# Altium schematic sheet UC3842内部梳理.SchDoc
size 1651 x 1651 mm; SheetNumber: 10; SheetTotal: 16
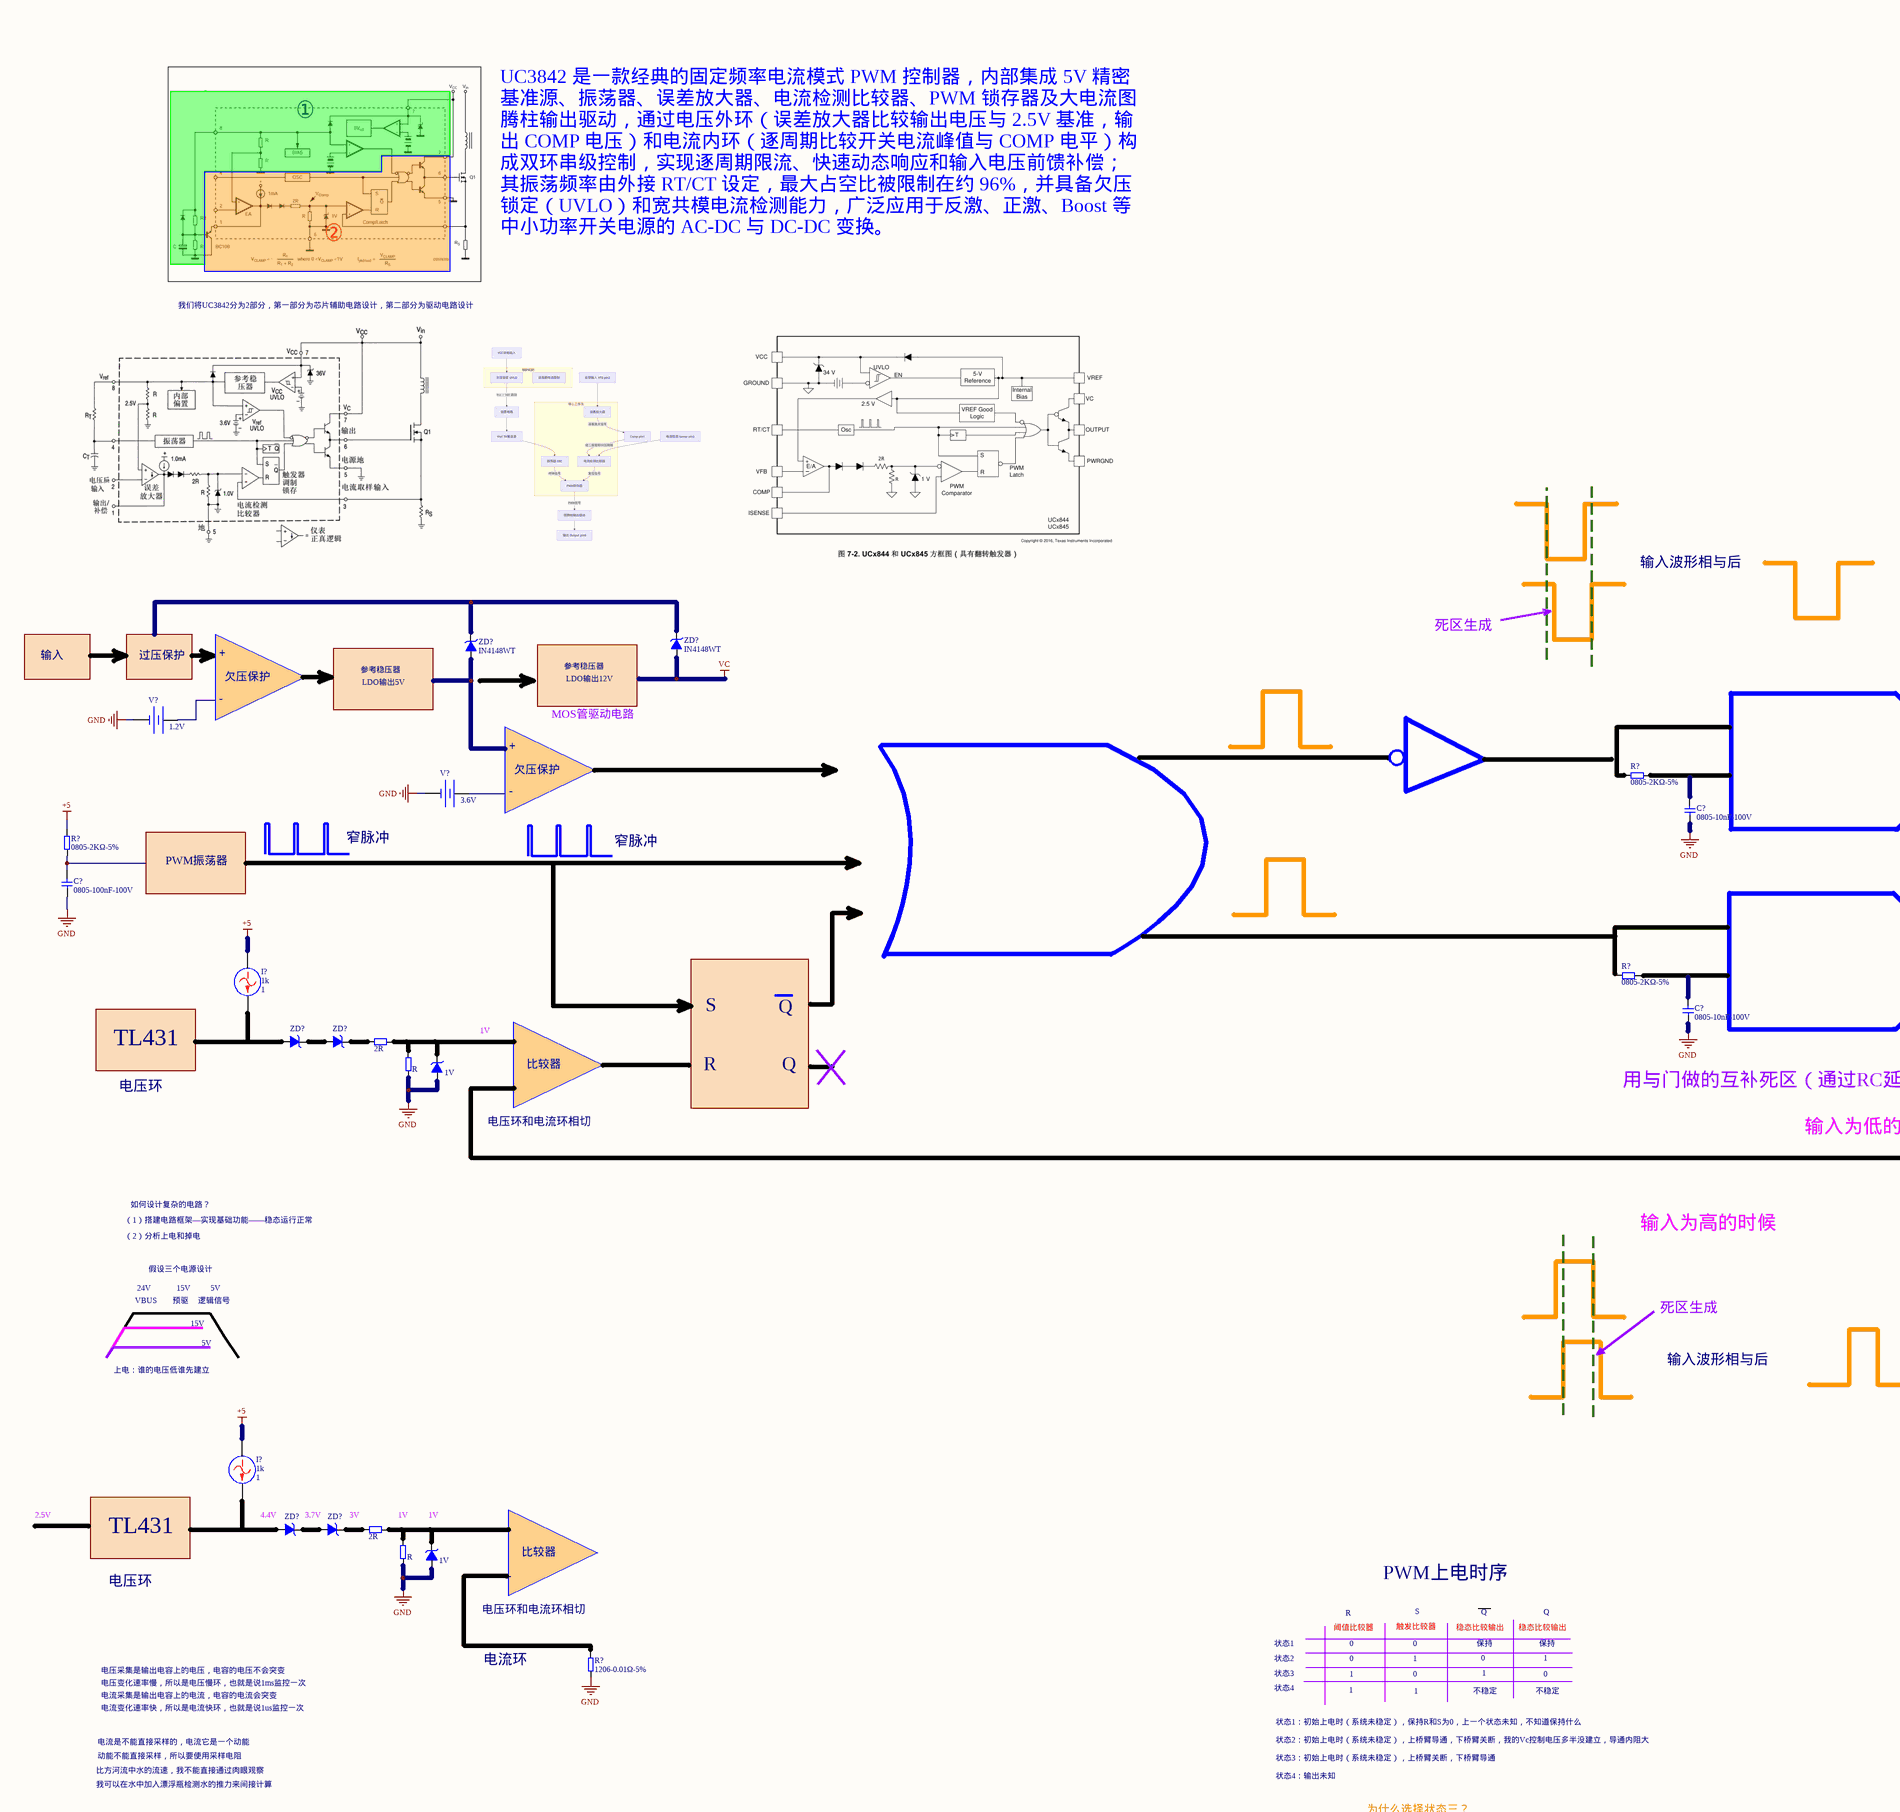
[diagram p0: UC3842内部梳理.SchDoc, top left]
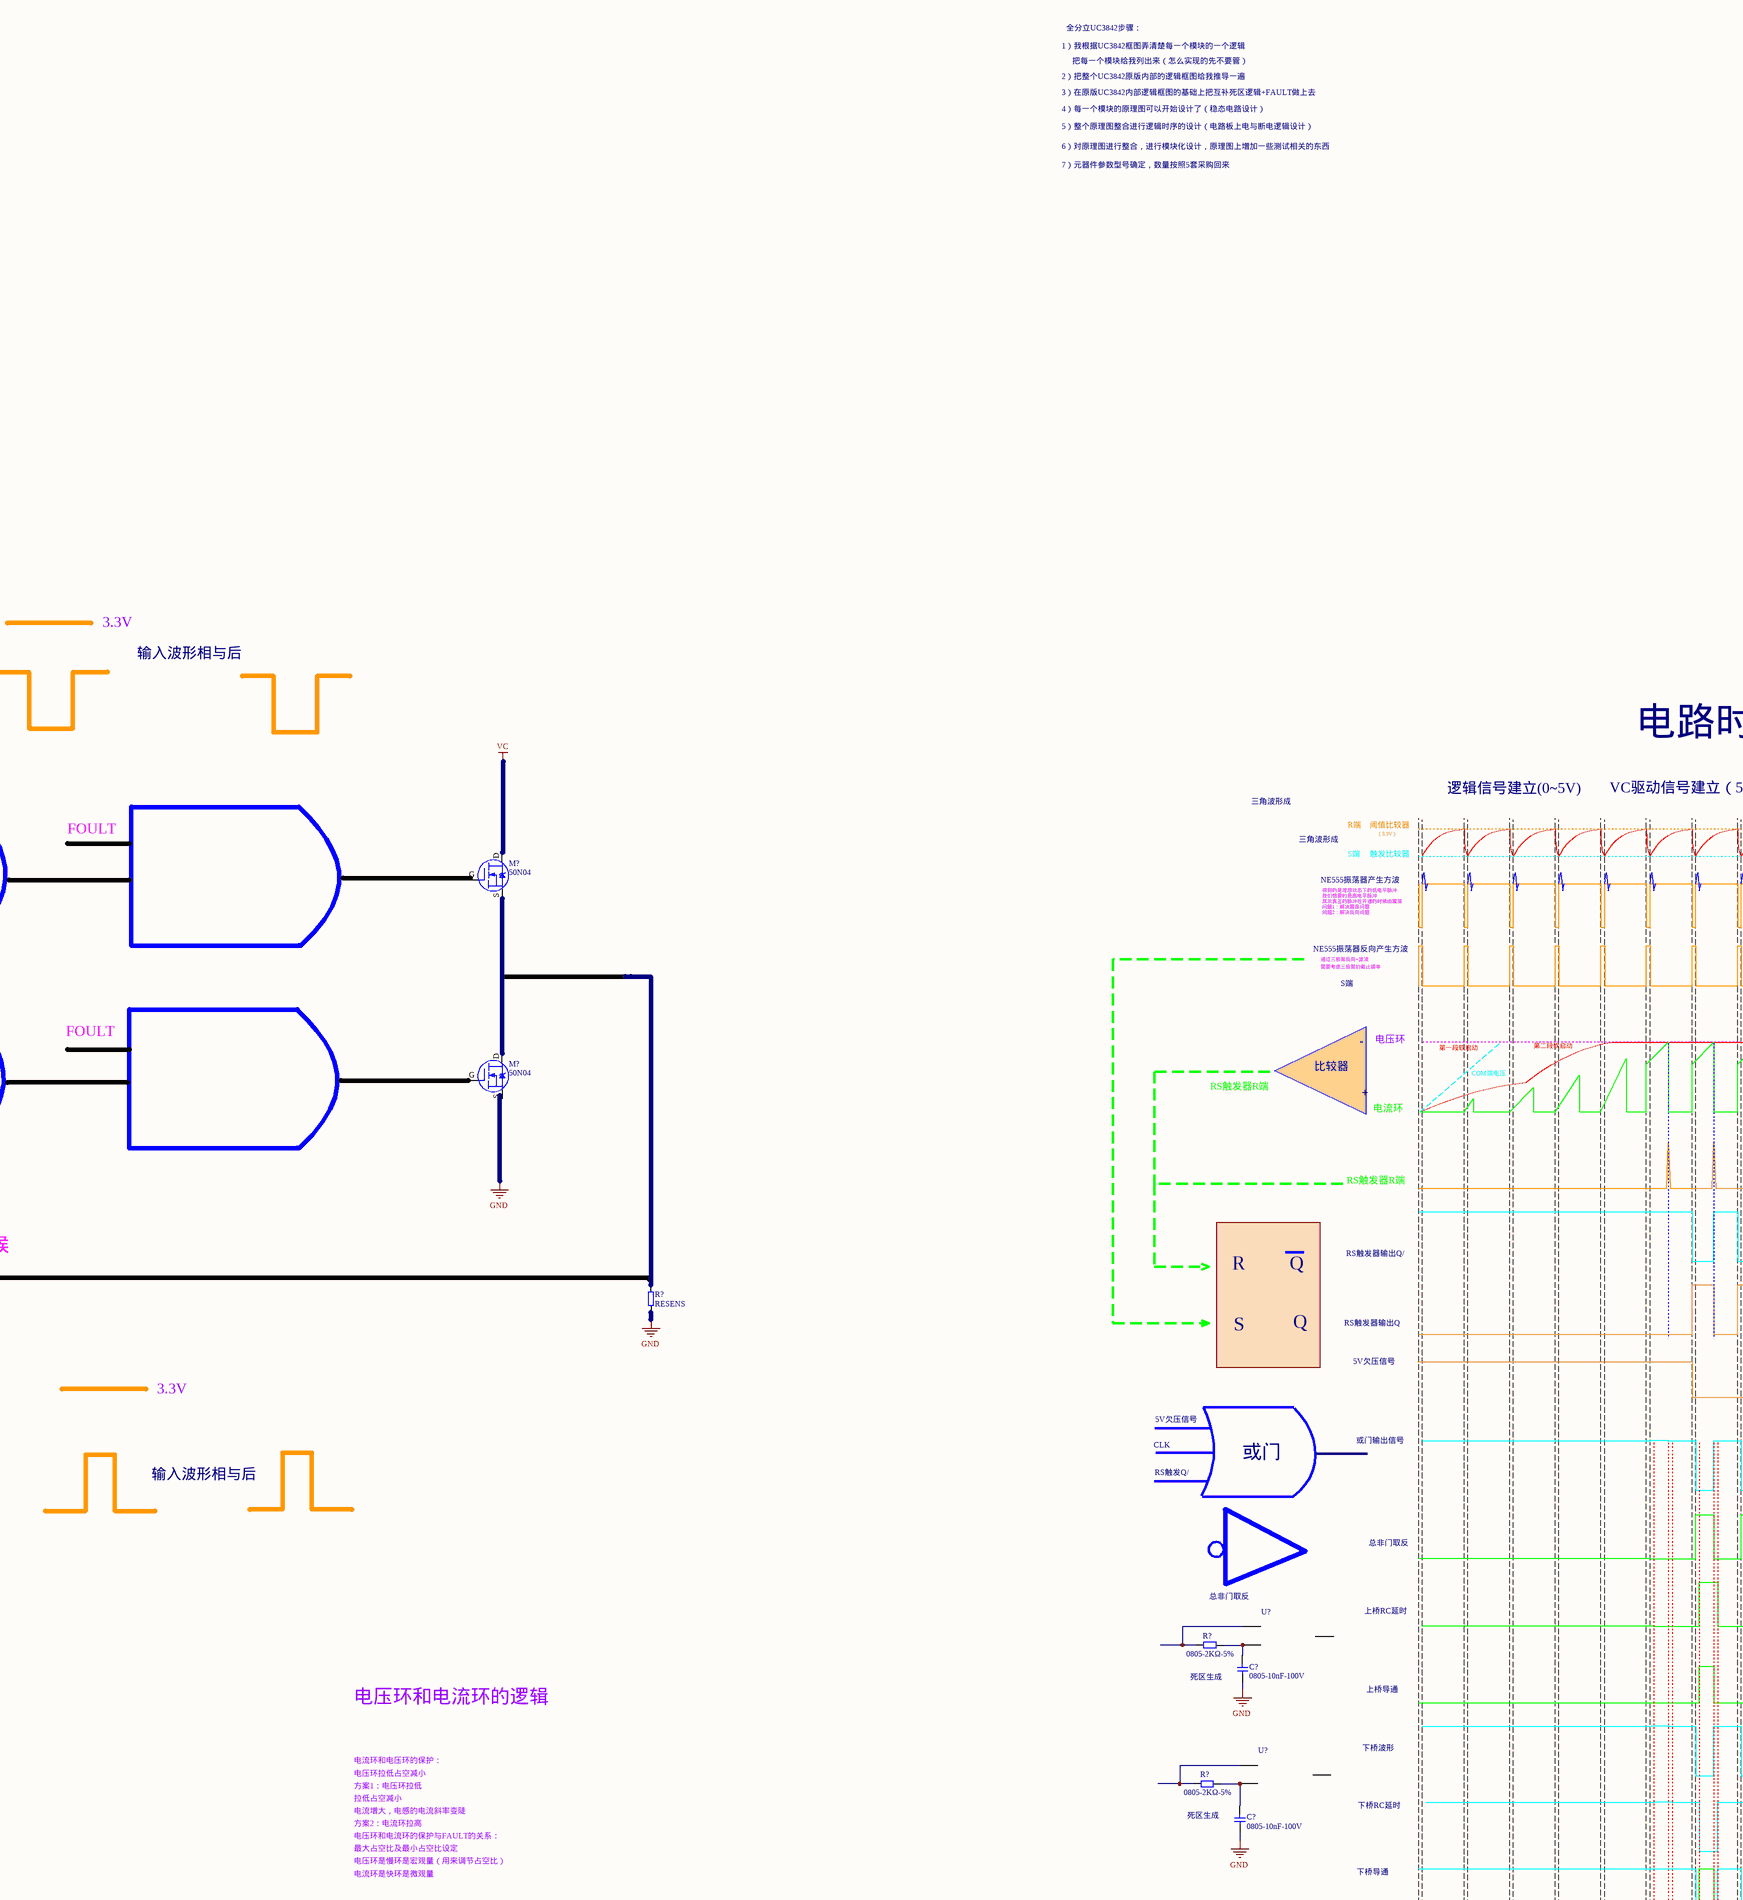
[diagram p1: UC3842内部梳理.SchDoc, top middle]
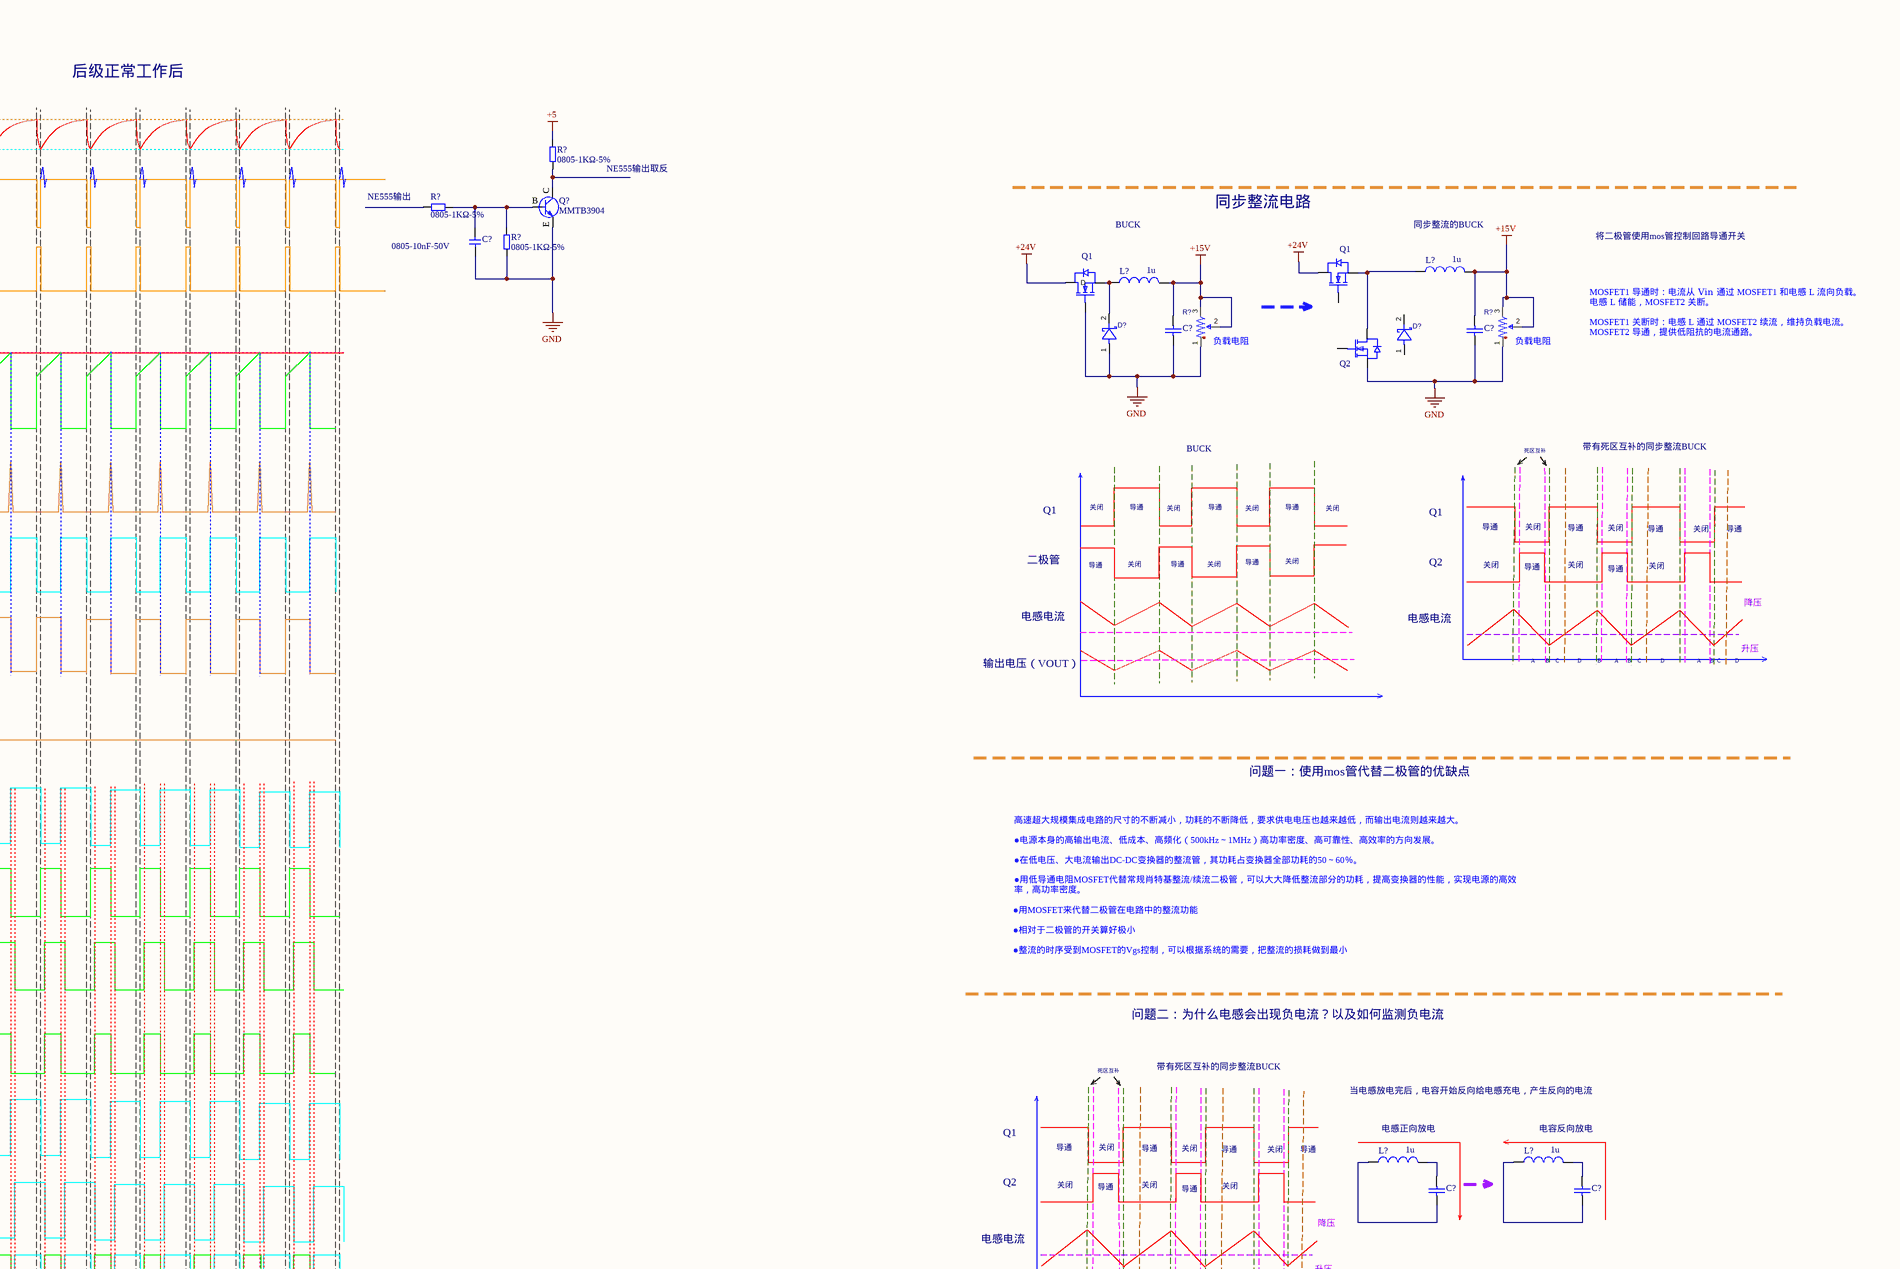
[diagram p2: UC3842内部梳理.SchDoc, top right]
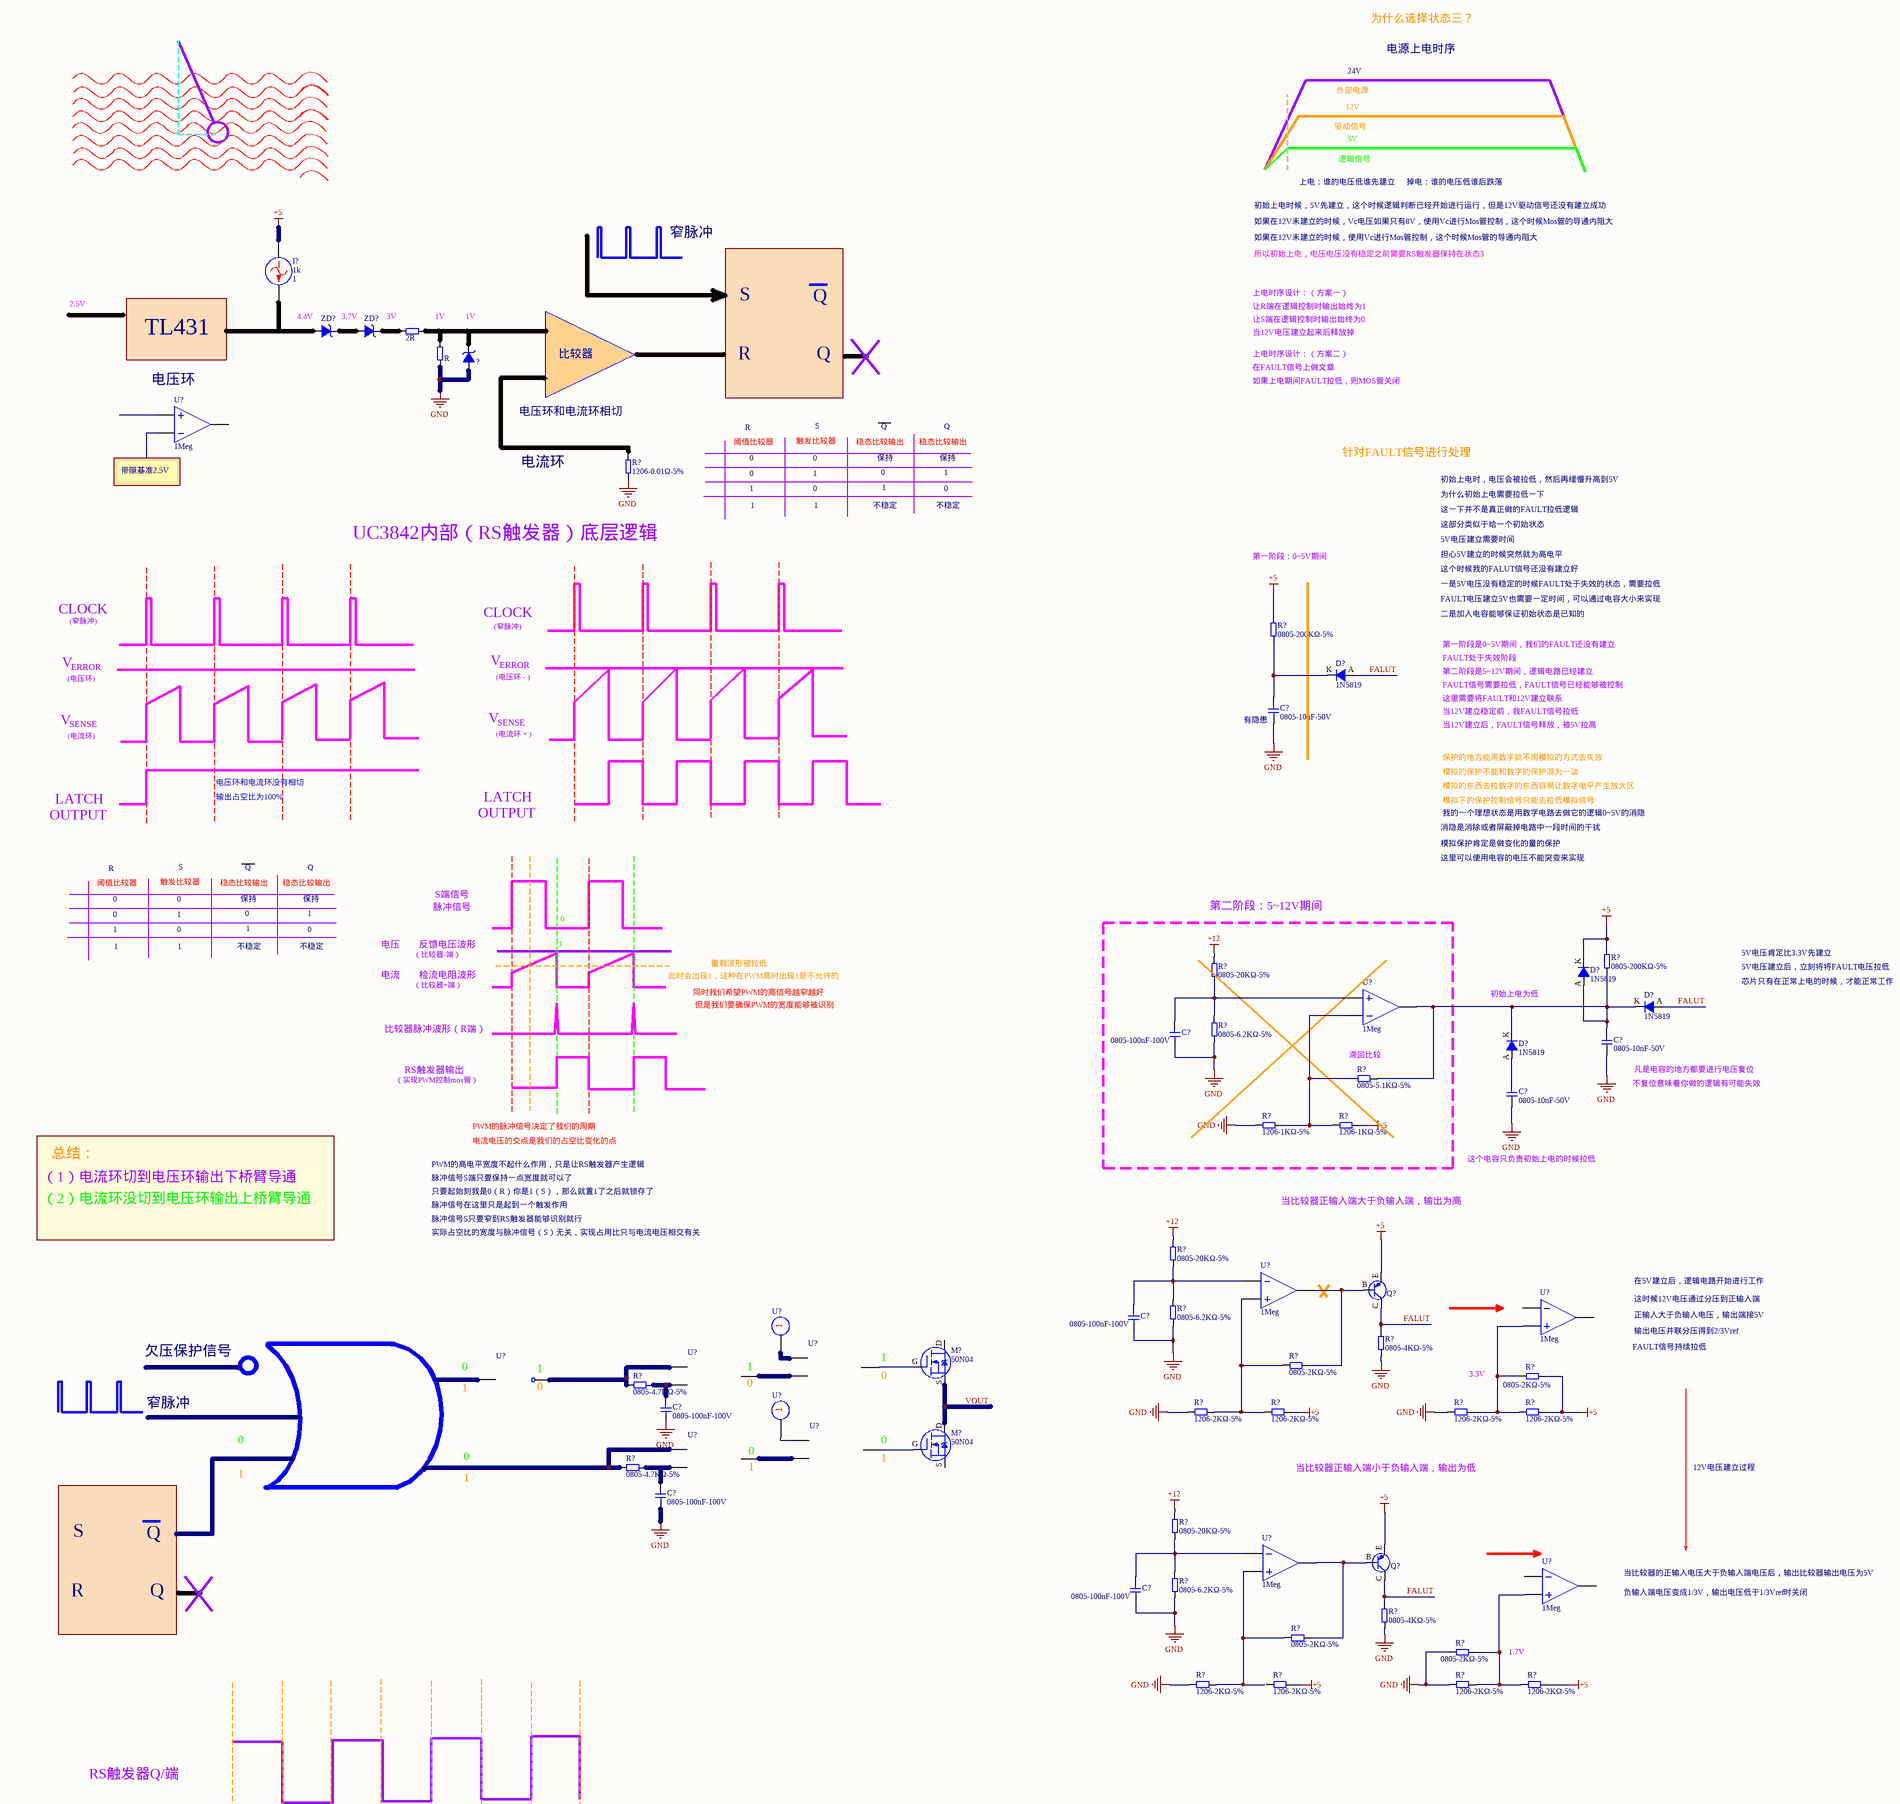
[diagram p3: UC3842内部梳理.SchDoc, centre left]
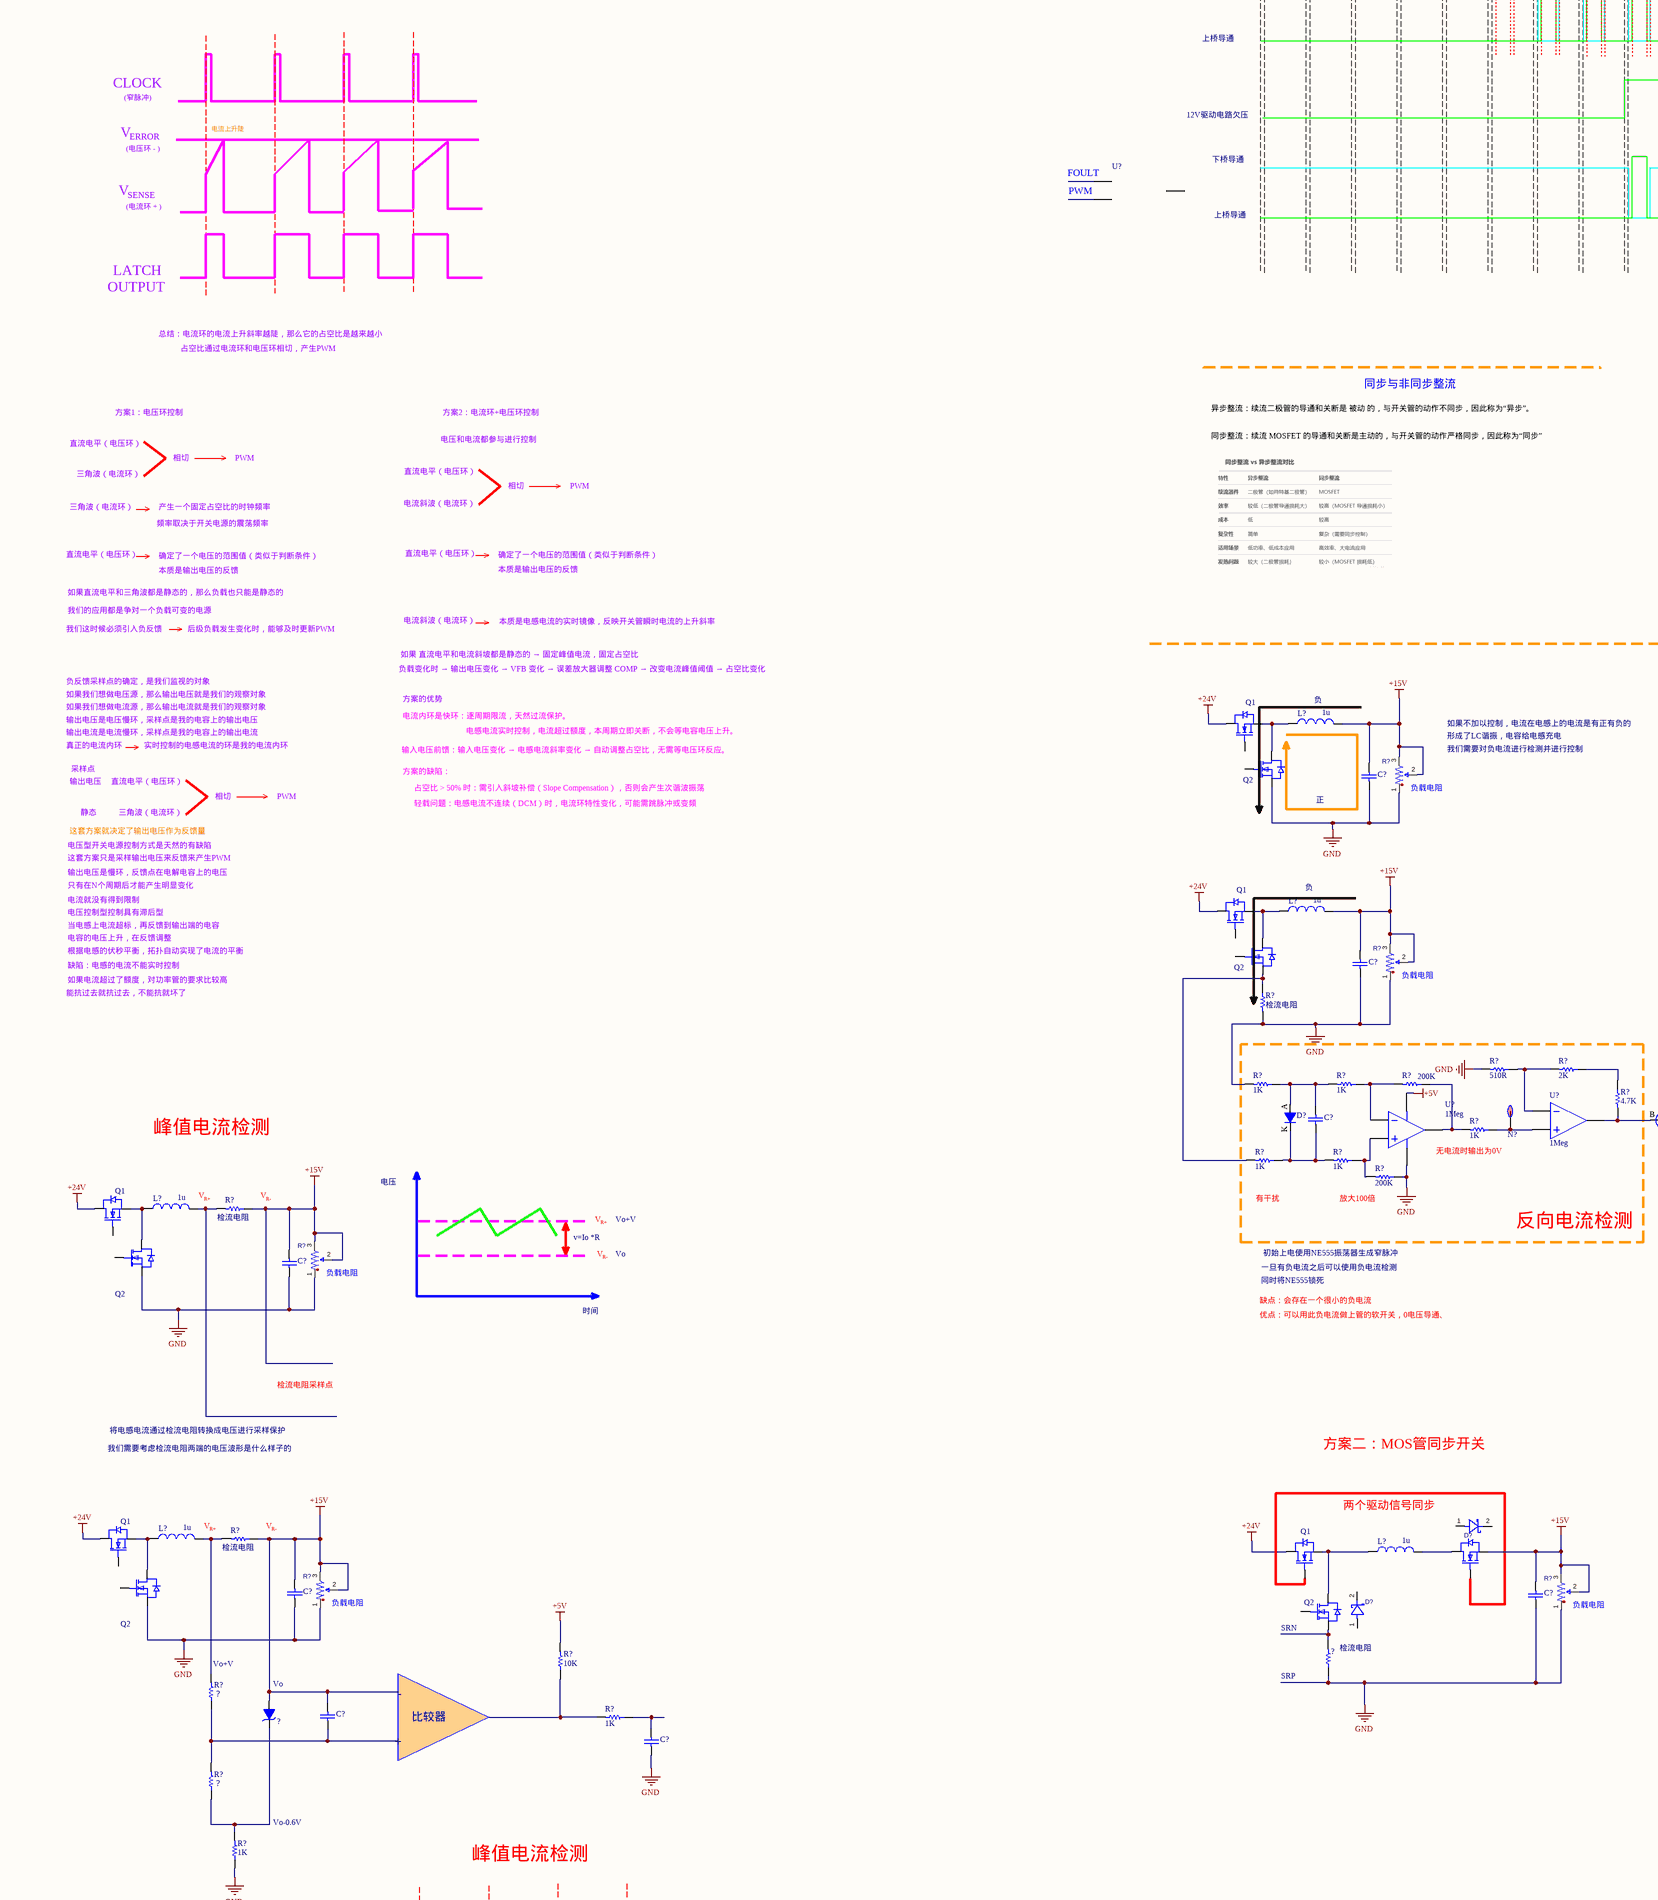
[diagram p4: UC3842内部梳理.SchDoc, centre middle]
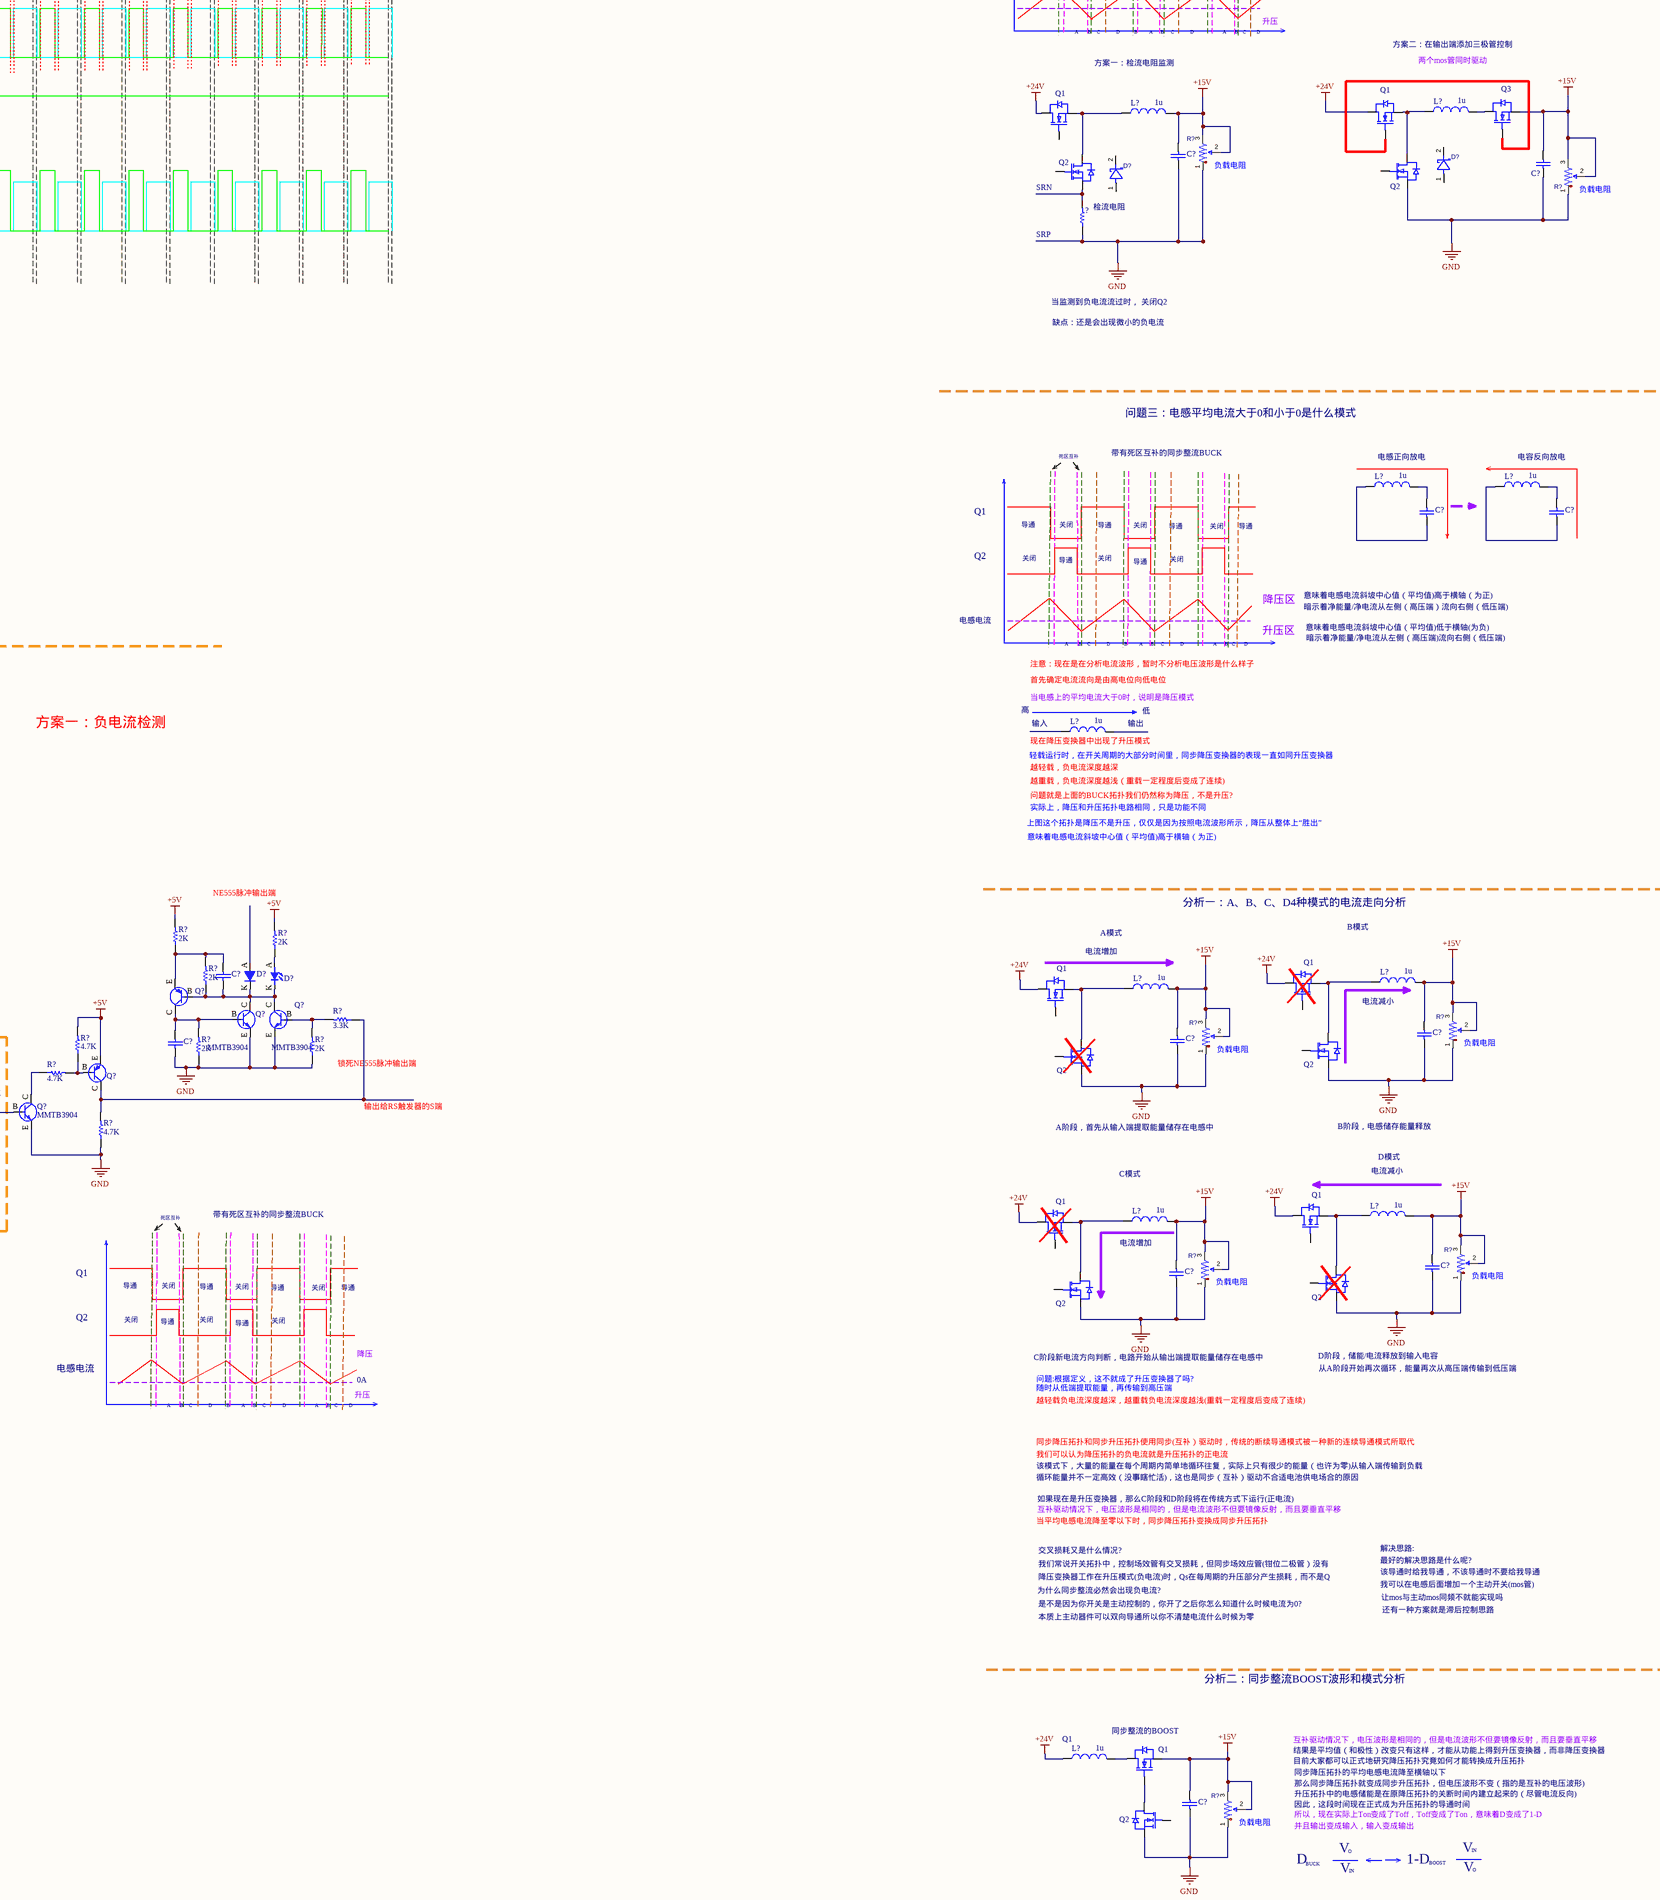
[diagram p5: UC3842内部梳理.SchDoc, centre right]
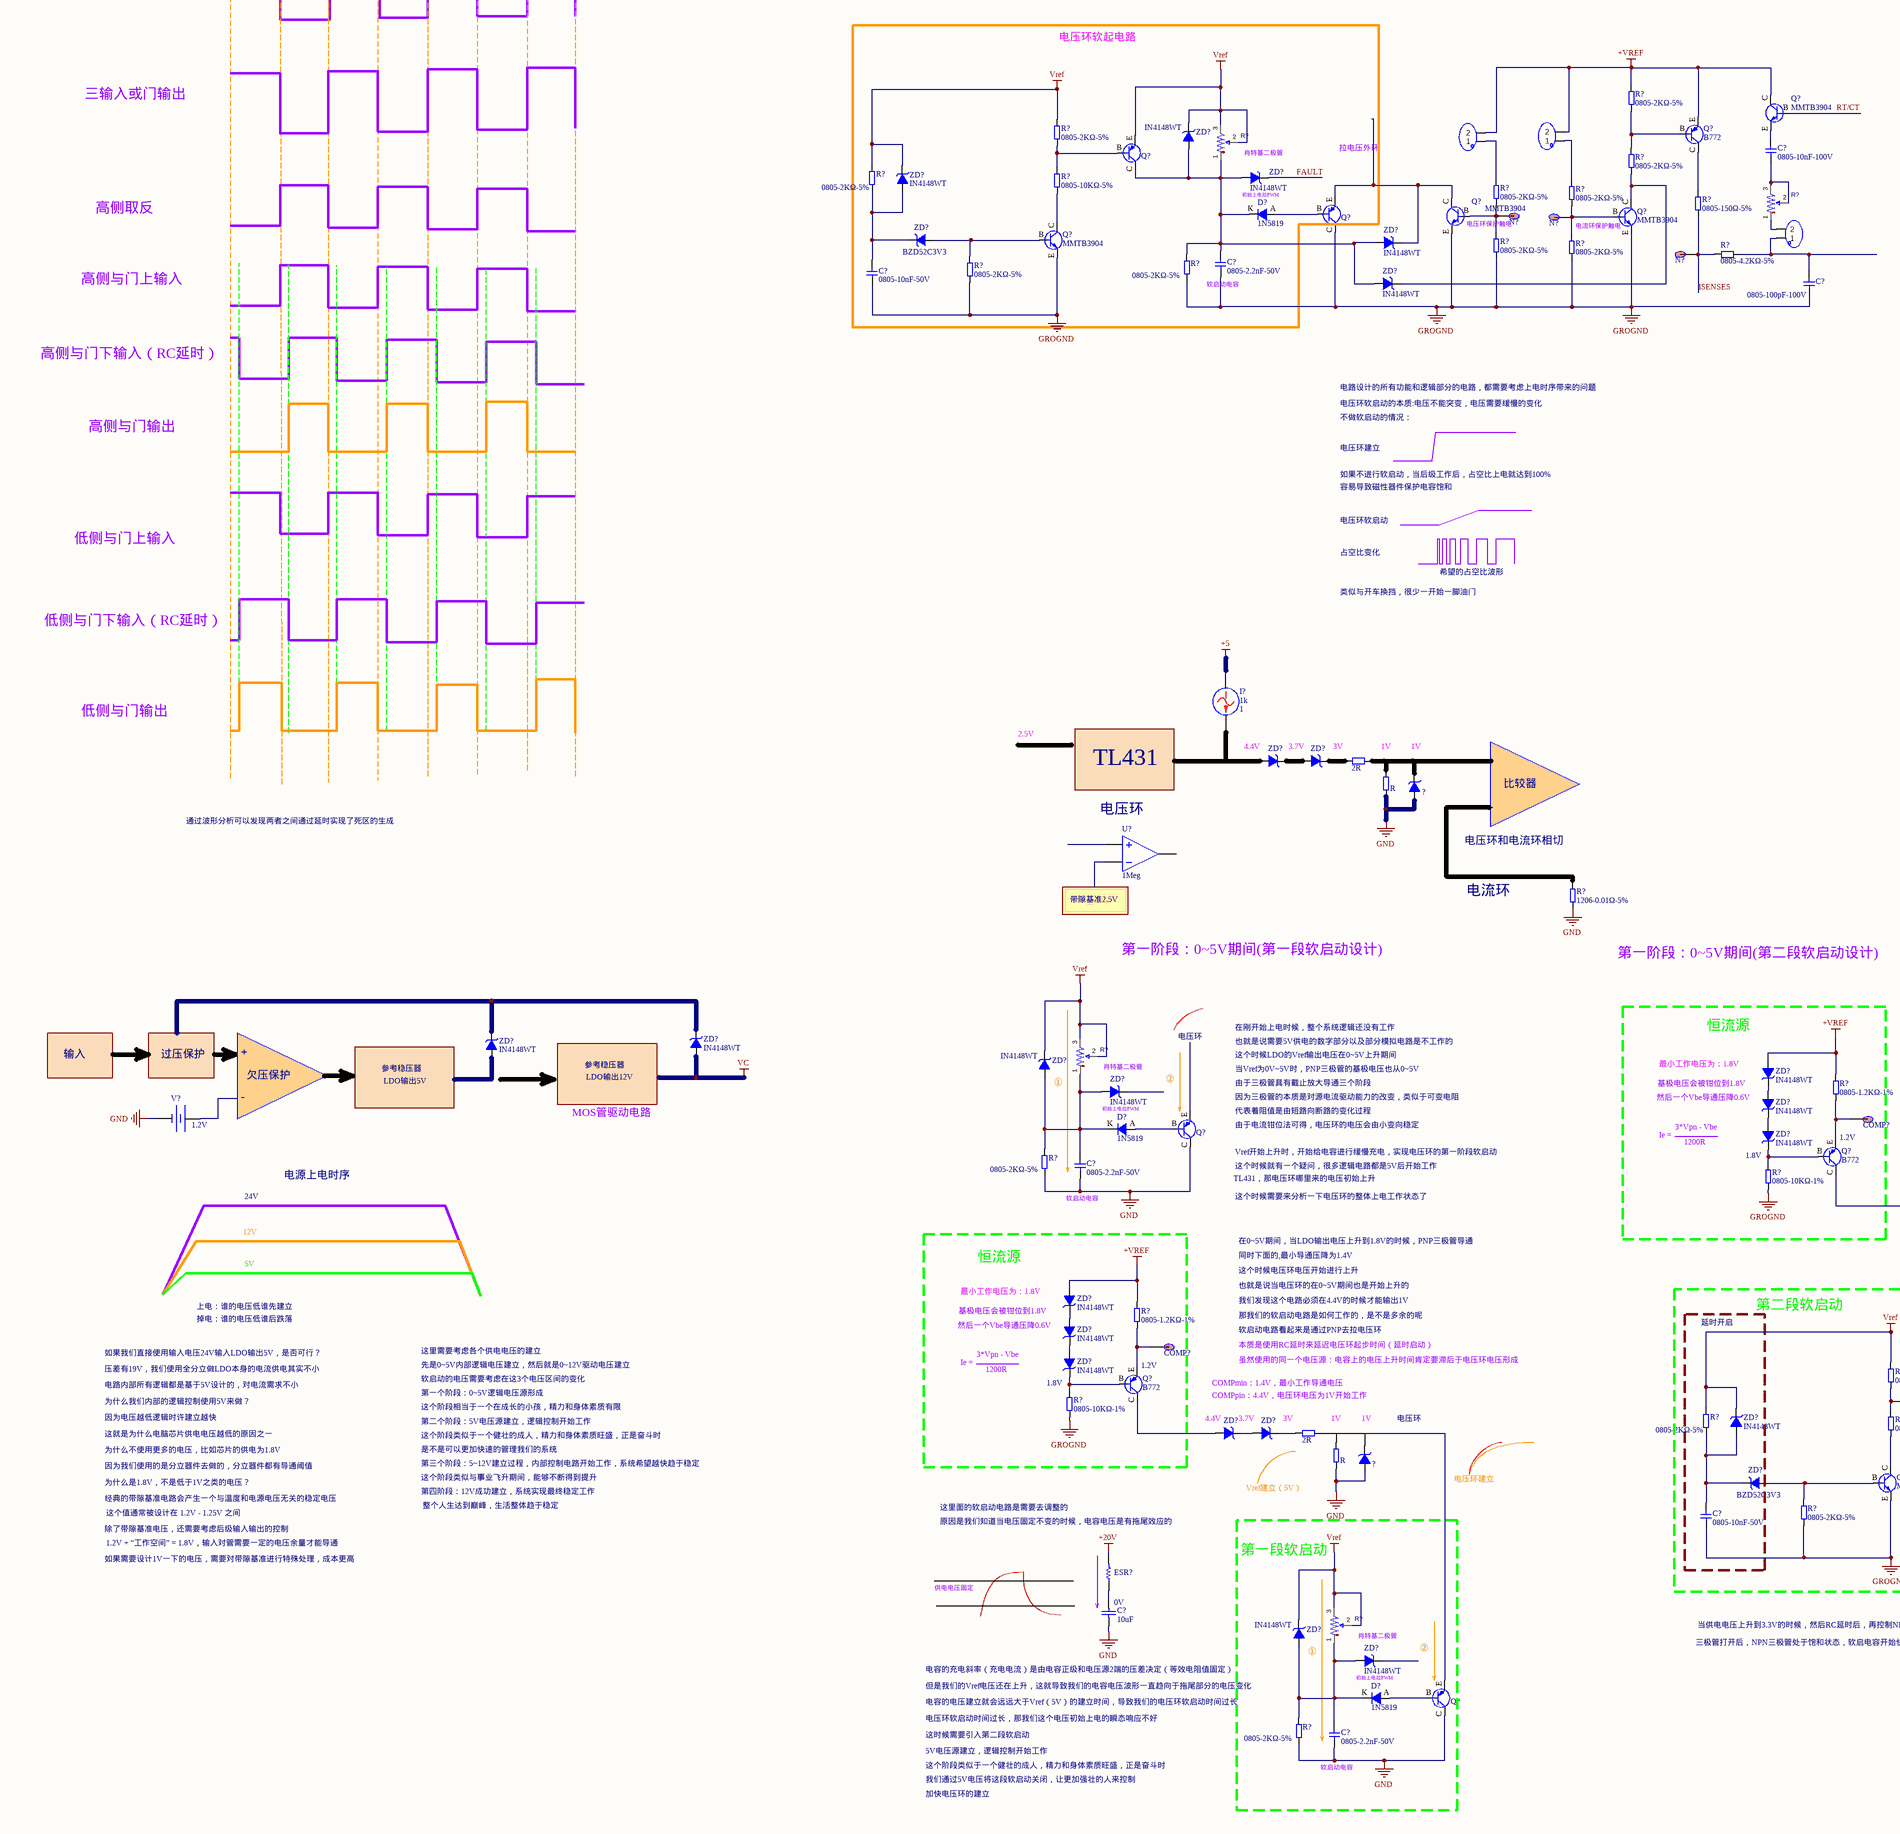
[diagram p6: UC3842内部梳理.SchDoc, bottom left]
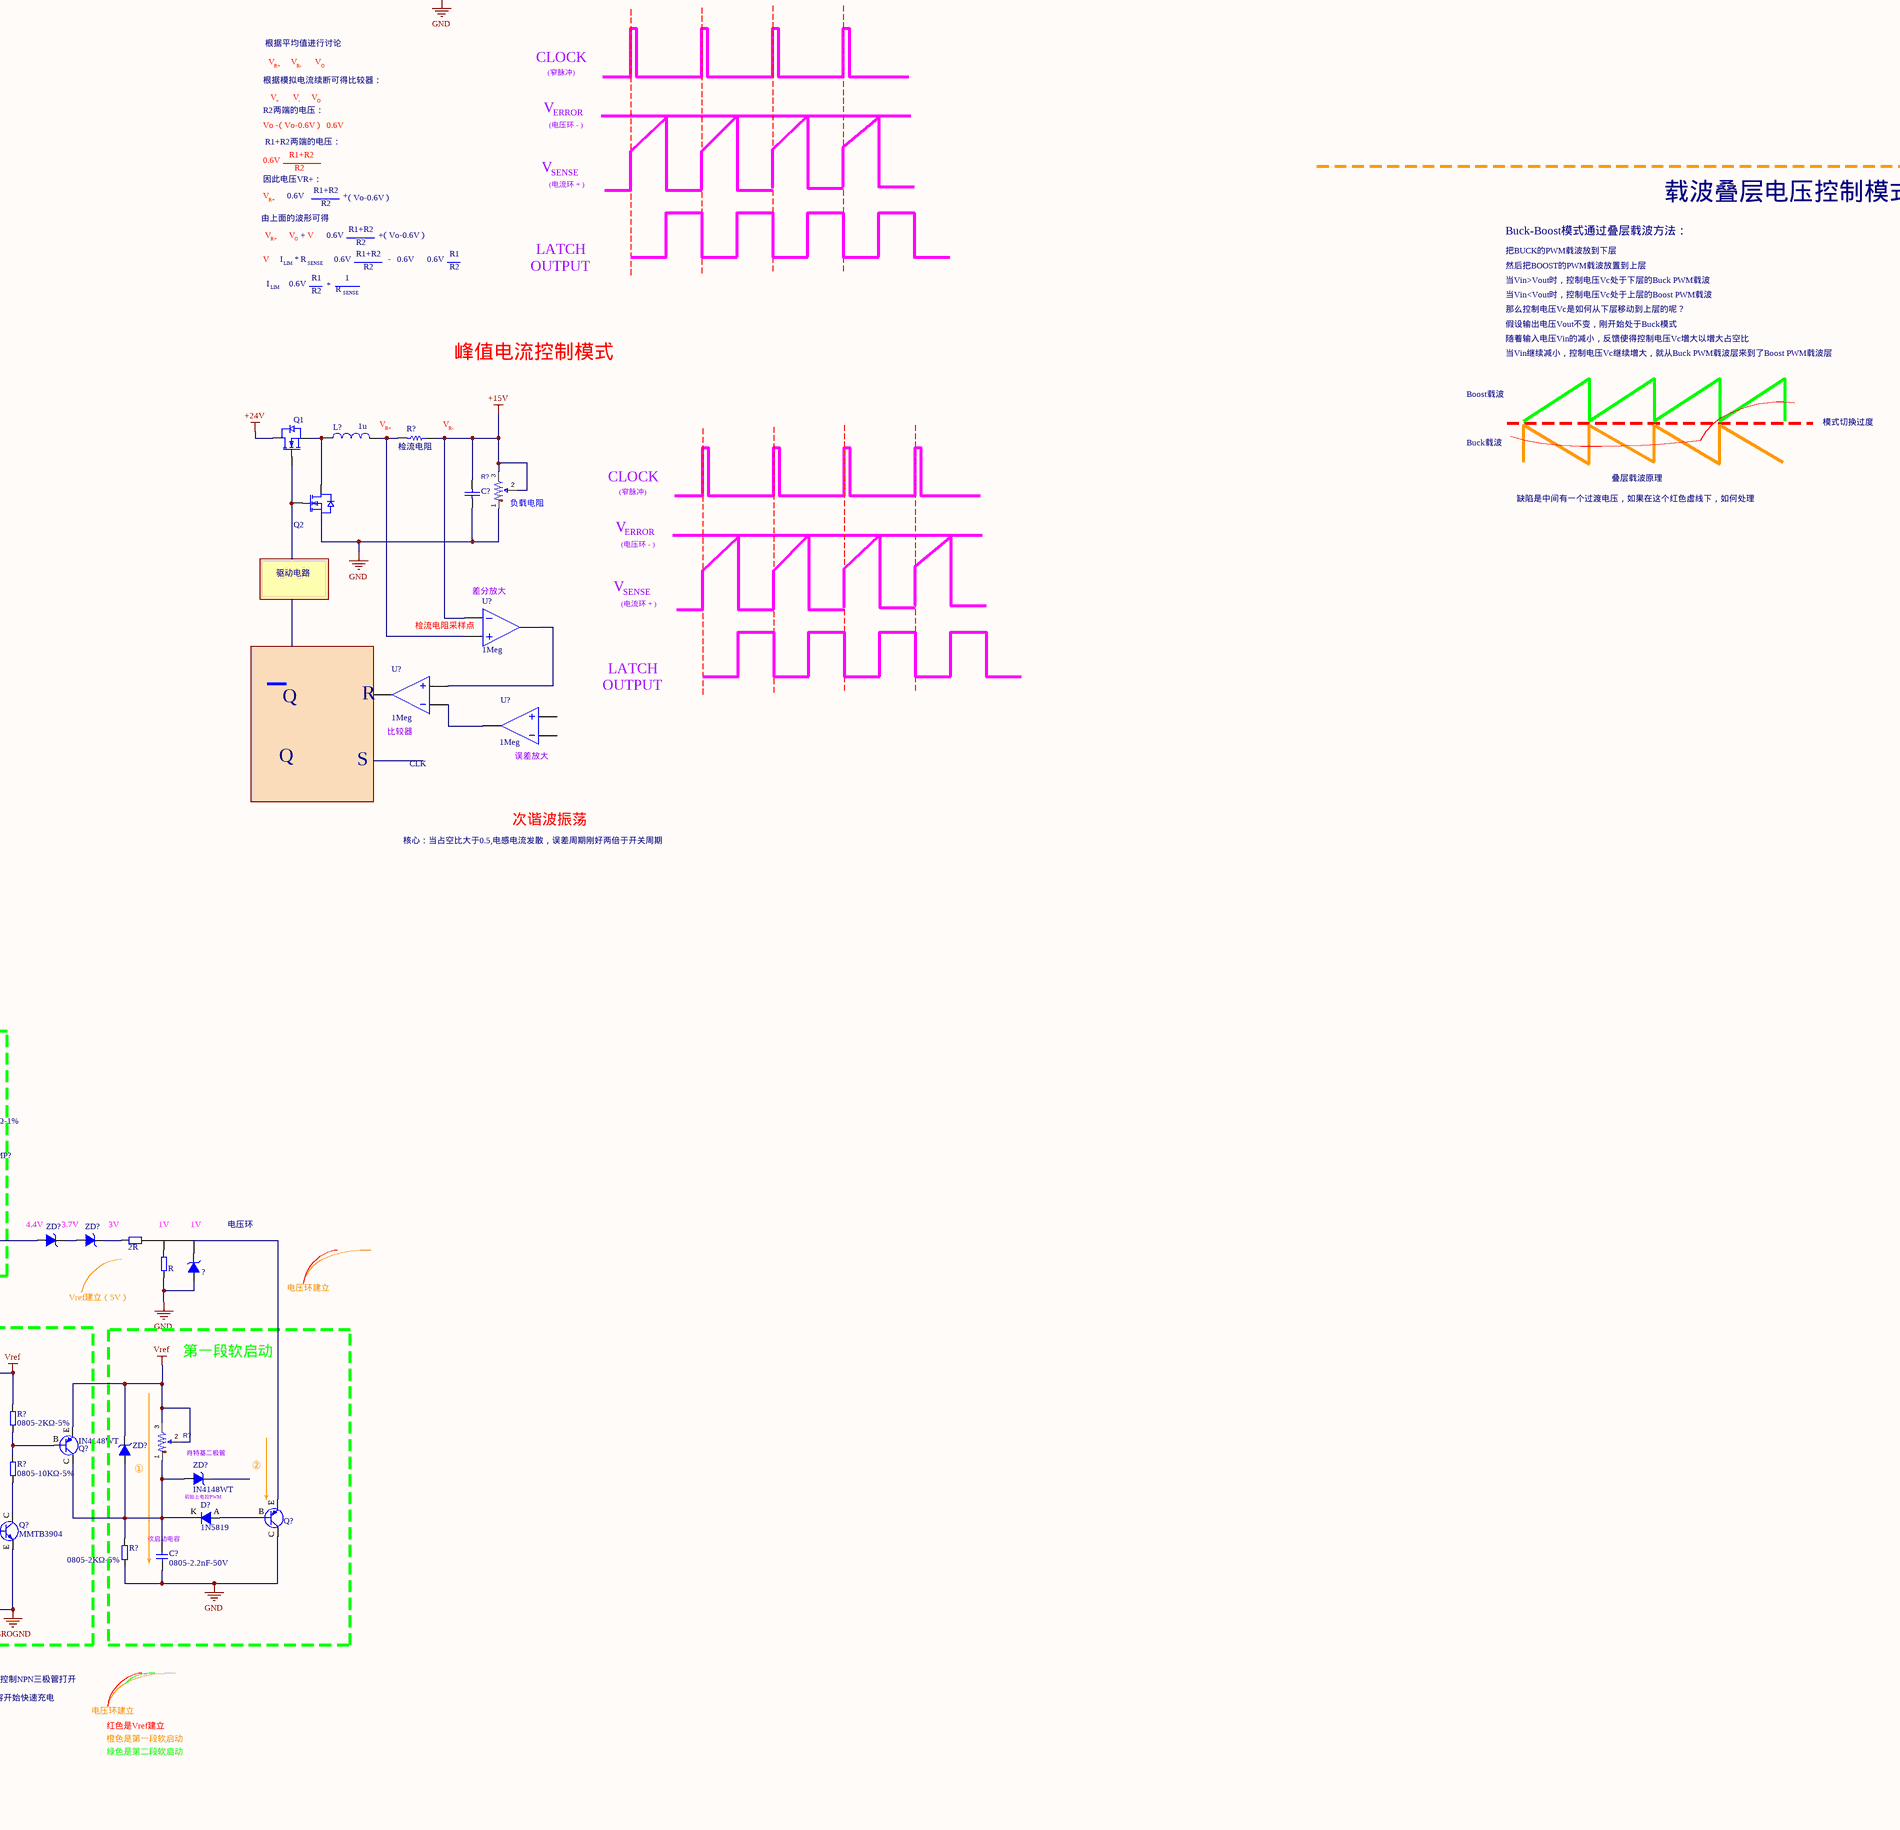
[diagram p7: UC3842内部梳理.SchDoc, bottom middle]
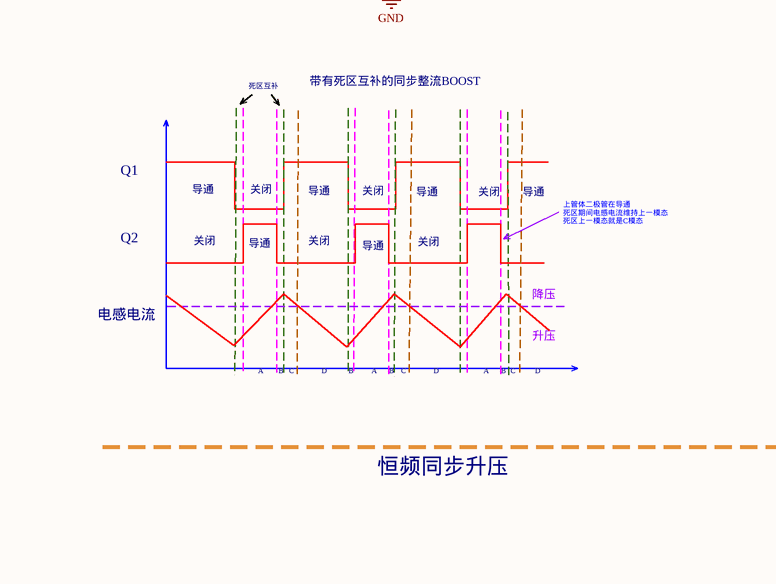
[diagram p8: UC3842内部梳理.SchDoc, bottom right]

## Parts
(Parts that share a designator on the sheet are numbered #1, #2 ... from top to bottom, then left to right.)
1V#1  BZD52C10V  [SOD123F]  (value not drawn)
1V#2  BZD52C10V  [SOD123F]  (value not drawn)
?#1  Resistor  (value not drawn)
?#2  BZD52C10V  [SOD123F]  (value not drawn)
?#3  Resistor  (value not drawn)
?#4  BZD52C10V  [SOD123F]  (value not drawn)
?#5  BZD52C10V  [SOD123F]  (value not drawn)
?#6  BZD52C10V  [SOD123F]  (value not drawn)
?#7  BZD52C10V  [SOD123F]  (value not drawn)
C?#1  0805-10nF-100V  [C-0805]
C?#2  0805-10nF-50V  [C-0805]
C?#3  0805-100nF-100V  [C-0805]
C?#4  Capacitor  (value not drawn)
C?#5  Capacitor  (value not drawn)
C?#6  0805-10nF-100V  [C-0805]
C?#7  0805-10nF-100V  [C-0805]
C?#8  0805-10nF-100V  [C-0805]
C?#9  Capacitor  (value not drawn)
C?#10  Capacitor  (value not drawn)
C?#11  Capacitor  (value not drawn)
C?#12  Capacitor  (value not drawn)
C?#13  Capacitor  (value not drawn)
C?#14  Capacitor  (value not drawn)
C?#15  0805-10nF-50V  [C-0805]
C?#16  Capacitor  (value not drawn)
C?#17  Capacitor  (value not drawn)
C?#18  Capacitor  (value not drawn)
C?#19  Capacitor  (value not drawn)
C?#20  Capacitor  (value not drawn)
C?#21  Capacitor  (value not drawn)
C?#22  0805-100nF-100V  [C-0805]
C?#23  0805-10nF-50V  [C-0805]
C?#24  Capacitor  (value not drawn)
C?#25  0805-10nF-50V  [C-0805]
C?#26  Capacitor  (value not drawn)
C?#27  Capacitor  (value not drawn)
C?#28  Capacitor  (value not drawn)
C?#29  0805-100nF-100V  [C-0805]
C?#30  0805-100nF-100V  [C-0805]
C?#31  0805-100nF-100V  [C-0805]
C?#32  Capacitor  (value not drawn)
C?#33  Capacitor  (value not drawn)
C?#34  0805-100nF-100V  [C-0805]
C?#35  Capacitor  (value not drawn)
C?#36  Capacitor  (value not drawn)
C?#37  Capacitor  (value not drawn)
C?#38  0805-10nF-100V  [C-0805]
C?#39  0805-2.2nF-50V  [C-0805]
C?#40  0805-10nF-50V  [C-0805]
C?#41  0805-100pF-100V  [C-0805]
C?#42  Capacitor  (value not drawn)
C?#43  0805-2.2nF-50V  [C-0805]
C?#44  0805-2.2nF-50V  [C-0805]
C?#45  0805-10nF-50V  [C-0805]
C?#46  value 10uF  (hidden comment: Capacitor)
C?#47  0805-2.2nF-50V  [C-0805]
COMP?#1  测试点  [测试点-RED_5000]  (value not drawn)
COMP?#2  测试点  [测试点-RED_5000]  (value not drawn)
D?#1  15V  (value not drawn)
D?#2  15V  (value not drawn)
D?#3  15V  (value not drawn)
D?#4  15V  (value not drawn)
D?#5  1N5819  [SOD123F]
D?#6  1N5819  [SOD123F]  (value not drawn)
D?#7  DIO_LED  [LED-0805-RED]  (value not drawn)
D?#8  1N5819  [SOD123F]
D?#9  1N5819  [SOD123F]
D?#10  1N5819  [SOD123F]  (value not drawn)
D?#11  1N5819  [SOD123F]
D?#12  15V  (value not drawn)
D?#13  15V  (value not drawn)
D?#14  1N5819  [SOD123F]
D?#15  1N5819  [SOD123F]
D?#16  1N5819  [SOD123F]
D?#17  1N5819  [SOD123F]
ESR?  Resistor  (value not drawn)
H?#1  pz254v-11-02p  [HDR-TH_2P-P2.54-V-M]  (value not drawn)
H?#2  pz254v-11-02p  [HDR-TH_2P-P2.54-V-M]  (value not drawn)
H?#3  pz254v-11-02p  [HDR-TH_2P-P2.54-V-M]  (value not drawn)
I?#1  Freq: 1k  Amp: 1  (hidden comment: AC Current Source)
I?#2  Freq: 1k  Amp: 1  (hidden comment: AC Current Source)
I?#3  Freq: 1k  Amp: 1  (hidden comment: AC Current Source)
I?#4  Freq: 1k  Amp: 1  (hidden comment: AC Current Source)
L?#1  value 1u  (hidden comment: Inductor)
L?#2  value 1u  (hidden comment: Inductor)
L?#3  value 1u  (hidden comment: Inductor)
L?#4  value 1u  (hidden comment: Inductor)
L?#5  value 1u  (hidden comment: Inductor)
L?#6  value 1u  (hidden comment: Inductor)
L?#7  value 1u  (hidden comment: Inductor)
L?#8  value 1u  (hidden comment: Inductor)
L?#9  value 1u  (hidden comment: Inductor)
L?#10  value 1u  (hidden comment: Inductor)
L?#11  value 1u  (hidden comment: Inductor)
L?#12  value 1u  (hidden comment: Inductor)
L?#13  value 1u  (hidden comment: Inductor)
L?#14  value 1u  (hidden comment: Inductor)
L?#15  value 1u  (hidden comment: Inductor)
L?#16  value 1u  (hidden comment: Inductor)
L?#17  value 1u  (hidden comment: Inductor)
L?#18  value 1u  (hidden comment: Inductor)
L?#19  value 1u  (hidden comment: Inductor)
L?#20  value 1u  (hidden comment: Inductor)
M?#1  50N04  [TO-252-2-GDS]
M?#2  50N04  [TO-252-2-GDS]
M?#3  50N04  [TO-252-2-GDS]
M?#4  50N04  [TO-252-2-GDS]
N?#1  测试点  [测试点-RED_5000]  (value not drawn)
N?#2  测试点  [测试点-RED_5000]  (value not drawn)
N?#3  测试点  [测试点-RED_5000]  (value not drawn)
N?#4  测试点  [测试点-RED_5000]  (value not drawn)
Q?#1  MMTB3904  [SOT-23]
Q?#2  2N7002,215  (value not drawn)
Q?#3  2N7002,215  (value not drawn)
Q?#4  2N7002,215  (value not drawn)
Q?#5  2N7002,215  (value not drawn)
Q?#6  2N7002,215  (value not drawn)
Q?#7  2N7002,215  (value not drawn)
Q?#8  2N7002,215  (value not drawn)
Q?#9  2N7002,215  (value not drawn)
Q?#10  2N7002,215  (value not drawn)
Q?#11  2N7002,215  (value not drawn)
Q?#12  2N7002,215  (value not drawn)
Q?#13  2N7002,215  (value not drawn)
Q?#14  2N7002,215  (value not drawn)
Q?#15  MMBT3906  [SOT-23]  (value not drawn)
Q?#16  2N7002,215  (value not drawn)
Q?#17  MMTB3904  [SOT-23]
Q?#18  MMTB3904  [SOT-23]
Q?#19  2N7002,215  (value not drawn)
Q?#20  2N7002,215  (value not drawn)
Q?#21  MMBT3906  [SOT-23]  (value not drawn)
Q?#22  MMTB3904  [SOT-23]
Q?#23  2N7002,215  (value not drawn)
Q?#24  2N7002,215  (value not drawn)
Q?#25  2N7002,215  (value not drawn)
Q?#26  2N7002,215  (value not drawn)
Q?#27  2N7002,215  (value not drawn)
Q?#28  2N7002,215  (value not drawn)
Q?#29  MMBT3906  [SOT-23]  (value not drawn)
Q?#30  2N7002,215  (value not drawn)
Q?#31  2N7002,215  (value not drawn)
Q?#32  2N7002,215  (value not drawn)
Q?#33  2N7002,215  (value not drawn)
Q?#34  2N7002,215  (value not drawn)
Q?#35  MMBT3906  [SOT-23]  (value not drawn)
Q?#36  2N7002,215  (value not drawn)
Q?#37  2N7002,215  (value not drawn)
Q?#38  MMTB3904  [SOT-23]
Q?#39  B772  [SOT-89(SOT-89-3)]
Q?#40  MMBT3906  [SOT-23]  (value not drawn)
Q?#41  MMBT3906  [SOT-23]  (value not drawn)
Q?#42  MMTB3904  [SOT-23]
Q?#43  MMTB3904  [SOT-23]
Q?#44  MMTB3904  [SOT-23]
Q?#45  2N7002,215  (value not drawn)
Q?#46  2N7002,215  (value not drawn)
Q?#47  MMBT3906  [SOT-23]  (value not drawn)
Q?#48  B772  [SOT-89(SOT-89-3)]
Q?#49  B772  [SOT-89(SOT-89-3)]
Q?#50  MMBT3906  [SOT-23]  (value not drawn)
Q?#51  MMBT3906  [SOT-23]  (value not drawn)
Q?#52  MMTB3904  [SOT-23]
Q?#53  MMBT3906  [SOT-23]  (value not drawn)
R?#1  0805-1KΩ-5%  [R-0805]
R?#2  0805-2KΩ-5%  [R-0805]
R?#3  0805-1KΩ-5%  [R-0805]
R?#4  0805-1KΩ-5%  [R-0805]
R?#5  0805-2KΩ-5%  [R-0805]
R?#6  负载电阻
R?#7  负载电阻
R?#8  0805-2KΩ-5%  [R-0805]
R?#9  2R  [R-0805]
R?#10  R  [R-0805]
R?#11  RESENS  [R-0805]
R?#12  0805-2KΩ-5%  [R-0805]
R?#13  2R  [R-0805]
R?#14  R  [R-0805]
R?#15  0805-2KΩ-5%  [R-0805]
R?#16  1206-0.01Ω-5%  [R-1206]
R?#17  负载电阻
R?#18  负载电阻
R?#19  2R  [R-0805]
R?#20  R  [R-0805]
R?#21  1206-0.01Ω-5%  [R-1206]
R?#22  0805-200KΩ-5%  [R-0805]
R?#23  负载电阻
R?#24  value 2K  (hidden comment: Resistor)
R?#25  负载电阻
R?#26  value 2K  (hidden comment: Resistor)
R?#27  value 检流电阻  (hidden comment: Resistor)
R?#28  value 2K  (hidden comment: Resistor)
R?#29  value 3.3K  (hidden comment: Resistor)
R?#30  0805-200KΩ-5%  [R-0805]
R?#31  负载电阻
R?#32  0805-20KΩ-5%  [R-0805]
R?#33  负载电阻
R?#34  value 510R  (hidden comment: Resistor)
R?#35  value 2K  (hidden comment: Resistor)
R?#36  value 4.7K  (hidden comment: Resistor)
R?#37  value 2K  (hidden comment: Resistor)
R?#38  value 2K  (hidden comment: Resistor)
R?#39  value 4.7K  (hidden comment: Resistor)
R?#40  value 4.7K  (hidden comment: Resistor)
R?#41  value 1K  (hidden comment: Resistor)
R?#42  value 1K  (hidden comment: Resistor)
R?#43  value 200K  (hidden comment: Resistor)
R?#44  0805-6.2KΩ-5%  [R-0805]
R?#45  value 1K  (hidden comment: Resistor)
R?#46  0805-5.1KΩ-5%  [R-0805]
R?#47  value 4.7K  (hidden comment: Resistor)
R?#48  value 1K  (hidden comment: Resistor)
R?#49  value 1K  (hidden comment: Resistor)
R?#50  value 200K  (hidden comment: Resistor)
R?#51  1206-1KΩ-5%  [R-1206]
R?#52  1206-1KΩ-5%  [R-1206]
R?#53  value 检流电阻  (hidden comment: Resistor)
R?#54  负载电阻
R?#55  负载电阻
R?#56  负载电阻
R?#57  0805-20KΩ-5%  [R-0805]
R?#58  0805-6.2KΩ-5%  [R-0805]
R?#59  0805-4KΩ-5%  [R-0805]
R?#60  0805-2KΩ-5%  [R-0805]
R?#61  0805-2KΩ-5%  [R-0805]
R?#62  0805-4.7KΩ-5%  [R-0805]
R?#63  1206-2KΩ-5%  [R-1206]
R?#64  1206-2KΩ-5%  [R-1206]
R?#65  1206-2KΩ-5%  [R-1206]
R?#66  1206-2KΩ-5%  [R-1206]
R?#67  0805-4.7KΩ-5%  [R-0805]
R?#68  value 检流电阻  (hidden comment: Resistor)
R?#69  负载电阻
R?#70  负载电阻
R?#71  0805-20KΩ-5%  [R-0805]
R?#72  0805-6.2KΩ-5%  [R-0805]
R?#73  value 10K  (hidden comment: Resistor)
R?#74  0805-4KΩ-5%  [R-0805]
R?#75  0805-2KΩ-5%  [R-0805]
R?#76  value ？  (hidden comment: Resistor)
R?#77  value 1K  (hidden comment: Resistor)
R?#78  0805-2KΩ-5%  [R-0805]
R?#79  1206-2KΩ-5%  [R-1206]
R?#80  1206-2KΩ-5%  [R-1206]
R?#81  1206-2KΩ-5%  [R-1206]
R?#82  1206-2KΩ-5%  [R-1206]
R?#83  value ？  (hidden comment: Resistor)
R?#84  负载电阻
R?#85  value 1K  (hidden comment: Resistor)
R?#86  0805-2KΩ-5%  [R-0805]
R?#87  3296W-1-103_C48997937  (value not drawn)
R?#88  0805-2KΩ-5%  [R-0805]
R?#89  0805-2KΩ-5%  [R-0805]
R?#90  0805-2KΩ-5%  [R-0805]
R?#91  0805-2KΩ-5%  [R-0805]
R?#92  0805-2KΩ-5%  [R-0805]
R?#93  0805-150Ω-5%  [R-0805]
R?#94  0805-10KΩ-5%  [R-0805]
R?#95  3296W-1-103_C48997937  (value not drawn)
R?#96  0805-2KΩ-5%  [R-0805]
R?#97  0805-2KΩ-5%  [R-0805]
R?#98  0805-4.2KΩ-5%  [R-0805]
R?#99  0805-2KΩ-5%  [R-0805]
R?#100  0805-2KΩ-5%  [R-0805]
R?#101  value 检流电阻  (hidden comment: Resistor)
R?#102  负载电阻
R?#103  2R  [R-0805]
R?#104  R  [R-0805]
R?#105  1206-0.01Ω-5%  [R-1206]
R?#106  3296W-1-103_C48997937  (value not drawn)
R?#107  0805-1.2KΩ-1%  [R-2512]
R?#108  0805-10KΩ-1%  [R-2512]
R?#109  0805-2KΩ-5%  [R-0805]
R?#110  2R  [R-0805]
R?#111  R  [R-0805]
R?#112  0805-1.2KΩ-1%  [R-2512]
R?#113  0805-10KΩ-1%  [R-2512]
R?#114  0805-2KΩ-5%  [R-0805]
R?#115  3296W-1-103_C48997937  (value not drawn)
R?#116  2R  [R-0805]
R?#117  0805-2KΩ-5%  [R-0805]
R?#118  0805-10KΩ-5%  [R-0805]
R?#119  R  [R-0805]
R?#120  0805-2KΩ-5%  [R-0805]
R?#121  0805-2KΩ-5%  [R-0805]
R?#122  3296W-1-103_C48997937  (value not drawn)
R?#123  0805-2KΩ-5%  [R-0805]
U?#1  Digital AND Gate  (value not drawn)
U?#2  Digital AND Gate  (value not drawn)
U?#3  Digital AND Gate  (value not drawn)
U?#4  GAIN: 1Meg  (hidden comment: Ideal Operational Amplifier)
U?#5  GAIN: 1Meg  (hidden comment: Ideal Operational Amplifier)
U?#6  GAIN: 1Meg  (hidden comment: Ideal Operational Amplifier)
U?#7  GAIN: 1Meg  (hidden comment: Ideal Operational Amplifier)
U?#8  GAIN: 1Meg  (hidden comment: Ideal Operational Amplifier)
U?#9  GAIN: 1Meg  (hidden comment: Ideal Operational Amplifier)
U?#10  Digital One Generator  (value not drawn)
U?#11  Digital AND Gate  (value not drawn)
U?#12  Digital AND Gate  (value not drawn)
U?#13  Digital NOT Gate  (value not drawn)
U?#14  Digital One Generator  (value not drawn)
U?#15  Digital AND Gate  (value not drawn)
U?#16  Digital AND Gate  (value not drawn)
U?#17  GAIN: 1Meg  (hidden comment: Ideal Operational Amplifier)
U?#18  GAIN: 1Meg  (hidden comment: Ideal Operational Amplifier)
U?#19  GAIN: 1Meg  (hidden comment: Ideal Operational Amplifier)
U?#20  GAIN: 1Meg  (hidden comment: Ideal Operational Amplifier)
U?#21  GAIN: 1Meg  (hidden comment: Ideal Operational Amplifier)
U?#22  GAIN: 1Meg  (hidden comment: Ideal Operational Amplifier)
V?#1  DC Magnitude: 1.2V  (hidden comment: Constant Voltage Source)
V?#2  DC Magnitude: 3.6V  (hidden comment: Constant Voltage Source)
V?#3  DC Magnitude: 1.2V  (hidden comment: Constant Voltage Source)
ZD?#1  IN4148WT  [SOD123F]
ZD?#2  IN4148WT  [SOD123F]
ZD?#3  BZD52C10V  [SOD123F]  (value not drawn)
ZD?#4  BZD52C10V  [SOD123F]  (value not drawn)
ZD?#5  BZD52C10V  [SOD123F]  (value not drawn)
ZD?#6  BZD52C10V  [SOD123F]  (value not drawn)
ZD?#7  BZD52C10V  [SOD123F]  (value not drawn)
ZD?#8  BZD52C10V  [SOD123F]  (value not drawn)
ZD?#9  IN4148WT  [SOD123F]
ZD?#10  IN4148WT  [SOD123F]
ZD?#11  IN4148WT  [SOD123F]
ZD?#12  BZD52C3V3  [SOD123F]
ZD?#13  IN4148WT  [SOD123F]
ZD?#14  IN4148WT  [SOD123F]
ZD?#15  BZD52C10V  [SOD123F]  (value not drawn)
ZD?#16  BZD52C10V  [SOD123F]  (value not drawn)
ZD?#17  IN4148WT  [SOD123F]
ZD?#18  IN4148WT  [SOD123F]
ZD?#19  IN4148WT  [SOD123F]
ZD?#20  IN4148WT  [SOD123F]
ZD?#21  IN4148WT  [SOD123F]
ZD?#22  IN4148WT  [SOD123F]
ZD?#23  IN4148WT  [SOD123F]
ZD?#24  BZD52C10V  [SOD123F]  (value not drawn)
ZD?#25  BZD52C10V  [SOD123F]  (value not drawn)
ZD?#26  IN4148WT  [SOD123F]
ZD?#27  IN4148WT  [SOD123F]
ZD?#28  IN4148WT  [SOD123F]
ZD?#29  IN4148WT  [SOD123F]
ZD?#30  BZD52C10V  [SOD123F]  (value not drawn)
ZD?#31  BZD52C10V  [SOD123F]  (value not drawn)
ZD?#32  IN4148WT  [SOD123F]
ZD?#33  IN4148WT  [SOD123F]
ZD?#34  BZD52C3V3  [SOD123F]
ZD?#35  IN4148WT  [SOD123F]
ZD?#36  IN4148WT  [SOD123F]

## Blocks framed on the sheet
第二阶段：5~12V期间: C?#22 R?#32 R?#44 R?#46 R?#51 R?#52 U?#5
反向电流检测: C?#24 D?#10 N?#1 R?#34 R?#35 R?#39 R?#41-R?#43 R?#45 R?#48-R?#50 U?#6 U?#7
电压环软起电路: C?#39 C?#40 D?#14 Q?#40 Q?#41 Q?#44 R?#87 R?#88 R?#92 R?#94 R?#99 R?#100 ZD?#9-ZD?#12
恒流源: COMP?#1 Q?#48 R?#107 R?#108 ZD?#19 ZD?#22 ZD?#23
恒流源: COMP?#2 Q?#49 R?#112 R?#113 ZD?#26-ZD?#28
延时开启: Q?#50 Q?#52 R?#114 R?#118 R?#121
第二段软启动: C?#45 R?#117 ZD?#32 ZD?#34
第一段软启动: C?#44 D?#16 Q?#51 R?#115 R?#120 ZD?#29 ZD?#33
第一段软启动: C?#47 D?#17 Q?#53 R?#122 R?#123 ZD?#35 ZD?#36

## Nets
+5: D?#8.K I?#1.2 I?#2.2 I?#3.2 I?#4.2 Q?#29.E Q?#35.E R?#1.2 R?#5.2 R?#22.2 R?#30.2 R?#52.2 R?#61.2 R?#64.2 R?#66.2 R?#80.2 R?#82.2
+5V: Q?#21.E R?#24.2 R?#26.2 R?#36.2 R?#73.2 U?#7.4(V+)
+12: R?#32.2 R?#57.2 R?#71.2
+15V: ?#4.A C?#4.2 C?#5.2 C?#11.2 C?#12.2 C?#16.2 C?#17.2 C?#19.2 C?#21.2 C?#26.2 C?#27.2 C?#28.2 C?#32.2 C?#33.2 C?#35.2 C?#37.2 C?#42.2 L?#1.2 L?#2.2 L?#5.2 L?#9.2 L?#11.2 L?#12.2 L?#13.2 L?#15.2 L?#16.2 Q?#7.2(S) Q?#32.2(S) Q?#36.2(S) R?#6.2 R?#6.3 R?#7.2 R?#7.3 R?#17.2 R?#17.3 R?#18.2 R?#18.3 R?#23.2 R?#23.3 R?#25.2 R?#25.3 R?#31.2 R?#31.3 R?#33.2 R?#33.3 R?#53.1 R?#54.2 R?#54.3 R?#55.2 R?#55.3 R?#56.2 R?#56.3 R?#68.1 R?#69.2 R?#69.3 R?#70.2 R?#70.3 R?#84.2 R?#84.3 R?#101.1 R?#102.2 R?#102.3 U?#19.1(IN-)
+20V: ESR?.2
+24V: L?#19.1 Q?#2.3(D) Q?#3.3(D) Q?#5.3(D) Q?#6.3(D) Q?#10.3(D) Q?#12.3(D) Q?#14.3(D) Q?#16.3(D) Q?#23.3(D) Q?#24.3(D) Q?#25.3(D) Q?#30.3(D) Q?#31.3(D) Q?#45.3(D)
+VREF: H?#1.2 H?#2.2 Q?#38.C Q?#39.E R?#86.1 R?#107.1 R?#112.1 ZD?#19.A ZD?#26.A
GND: 1V#1.A 1V#2.A ?#1.1 ?#2.A ?#3.1 ?#5.A ?#6.A ?#7.A C?#1.2 C?#2.2 C?#3.2 C?#4.1 C?#5.1 C?#6.2 C?#7.2 C?#8.2 C?#11.1 C?#12.1 C?#15.2 C?#16.1 C?#17.1 C?#19.1 C?#20.1 C?#21.1 C?#22.1 C?#23.2 C?#25.2 C?#26.1 C?#27.1 C?#28.1 C?#29.1 C?#31.2 C?#32.1 C?#33.1 C?#34.1 C?#36.1 C?#37.1 C?#42.1 C?#43.2 C?#44.2 C?#46.1 C?#47.2 D?#1.1(A) Q?#1.E Q?#3.1(G) Q?#4.2(S) Q?#9.2(S) Q?#11.2(S) Q?#17.E Q?#18.E Q?#19.2(S) Q?#20.2(S) Q?#22.E Q?#26.2(S) Q?#27.2(S) Q?#28.2(S) Q?#33.2(S) Q?#37.2(S) Q?#46.2(S) Q?#47.C Q?#51.C Q?#53.C R?#4.1 R?#6.1 R?#7.1 R?#10.1 R?#11.1 R?#14.1 R?#16.1 R?#17.1 R?#18.1 R?#20.1 R?#21.1 R?#23.1 R?#25.1 R?#27.2 R?#31.1 R?#33.1 R?#34.2 R?#37.1 R?#38.1 R?#41.2 R?#44.1 R?#47.1 R?#50.1 R?#51.1 R?#54.1 R?#55.1 R?#56.1 R?#58.1 R?#59.1 R?#63.1 R?#65.1 R?#69.1 R?#70.1 R?#72.1 R?#74.1 R?#78.2 R?#79.1 R?#81.1 R?#84.1 R?#85.1 R?#102.1 R?#104.1 R?#105.1 R?#109.1 R?#111.1 R?#119.1 R?#120.1 R?#123.1 U?#7.5(V-) V?#1.2 V?#2.2 V?#3.2
GROGND: C?#39.2 C?#40.2 C?#41.2 C?#45.2 Q?#41.C Q?#42.E Q?#43.E Q?#44.E Q?#52.E R?#96.2 R?#97.2 R?#99.1 R?#100.1 R?#108.2 R?#113.2 R?#121.1
VC: M?#1.D ZD?#2.A ZD?#18.A
Vref: Q?#40.E Q?#50.E R?#87.2 R?#87.3 R?#88.2 R?#92.2 R?#106.2 R?#106.3 R?#114.2 R?#115.2 R?#115.3 R?#117.2 R?#122.2 R?#122.3 ZD?#9.K ZD?#11.K ZD?#20.K ZD?#29.K ZD?#32.K ZD?#35.K
FALUT: D?#5.A D?#9.A Q?#29.C Q?#35.C R?#59.2 R?#74.2
FAULT: ZD?#10.K
ISENSES: N?#4.1 R?#93.2 R?#98.1
RT/CT: Q?#38.B
VOUT: M?#3.S M?#4.D
Net?#1_2: ?#1.2 Q?#8.2(S)
Net?#3_2: ?#3.2 Q?#34.2(S)
Net?#4_K: ?#4.K R?#83.1 R?#85.2
NetC?#2_1: C?#2.1 Q?#1.B R?#3.2 R?#4.2
NetC?#3_1: C?#3.1 R?#5.1
NetC?#7_1: C?#7.1 R?#12.2 U?#1.2
NetC?#8_1: C?#8.1 R?#15.2 U?#2.2
NetC?#9_1: C?#9.1 L?#3.1
NetC?#9_2: C?#9.2 L?#3.2
NetC?#10_1: C?#10.1 L?#4.1
NetC?#10_2: C?#10.2 L?#4.2
NetC?#13_1: C?#13.1 L?#7.1
NetC?#13_2: C?#13.2 L?#7.2
NetC?#14_1: C?#14.1 L?#8.1
NetC?#14_2: C?#14.2 L?#8.2
NetC?#15_1: C?#15.1 D?#5.K R?#22.1
NetC?#18_1: C?#18.1 D?#6.K D?#7.K Q?#15.B Q?#17.C Q?#18.C R?#28.1
NetC?#18_2: C?#18.2 Q?#15.E R?#24.1 R?#28.2
NetC?#20_2: C?#20.2 Q?#15.C Q?#17.B R?#37.2
NetC?#22_2: C?#22.2 R?#32.1 R?#44.2 U?#5.2(IN+)
NetC?#23_1: C?#23.1 D?#8.A D?#9.K D?#11.K R?#30.1 R?#46.2 U?#5.3(OUT)
NetC?#24_1: C?#24.1 D?#10.K R?#48.1 R?#49.2
NetC?#24_2: C?#24.2 D?#10.A R?#41.1 R?#42.2
NetC?#25_1: C?#25.1 D?#11.A
NetC?#29_2: C?#29.2 R?#57.1 R?#58.2 U?#8.1(IN-)
NetC?#30_1: C?#30.1 R?#62.2 U?#12.2
NetC?#34_2: C?#34.2 R?#71.1 R?#72.2 U?#17.1(IN-)
NetC?#35_1: C?#35.1 R?#76.1 R?#83.2
NetC?#36_2: C?#36.2 R?#77.1
NetC?#38_1: C?#38.1 Q?#38.E
NetC?#38_2: C?#38.2 R?#95.2 R?#95.3
NetC?#39_1: C?#39.1 D?#14.K Q?#40.C R?#87.1 R?#100.2 ZD?#9.A ZD?#10.A ZD?#13.A ZD?#14.A
NetC?#40_1: C?#40.1 R?#92.1 ZD?#11.A ZD?#12.K
NetC?#41_1: C?#41.1 H?#3.1 R?#98.2
NetC?#43_1: C?#43.1 D?#15.K R?#106.1 R?#109.2 ZD?#20.A ZD?#21.A
NetC?#44_1: C?#44.1 D?#16.K Q?#50.C R?#115.1 R?#120.2 ZD?#29.A ZD?#33.A
NetC?#45_1: C?#45.1 R?#117.1 ZD?#32.A ZD?#34.K
NetC?#46_2: C?#46.2 ESR?.1
NetC?#47_1: C?#47.1 D?#17.K R?#122.1 R?#123.2 ZD?#35.A ZD?#36.A
NetCOMP?#1_1: COMP?#1.1 Q?#48.E R?#107.2
NetCOMP?#2_1: COMP?#2.1 Q?#49.E R?#112.2
NetD?#1_2: D?#1.2(K) L?#2.1 Q?#3.2(S)
NetD?#7_A: D?#7.A R?#26.1
NetD?#14_A: D?#14.A Q?#41.B
NetD?#15_A: D?#15.A Q?#47.B
NetD?#16_A: D?#16.A Q?#51.B
NetD?#17_A: D?#17.A Q?#53.B
NetH?#1_1: H?#1.1 R?#90.1
NetH?#2_1: H?#2.1 R?#91.1
NetH?#3_2: H?#3.2 R?#95.1
NetL?#1_1: L?#1.1 Q?#2.2(S) Q?#4.3(D)
NetL?#5_1: L?#5.1 Q?#5.2(S) Q?#8.3(D)
NetL?#6_1: L?#6.1 Q?#6.2(S) Q?#9.3(D)
NetL?#6_2: L?#6.2 Q?#7.3(D)
NetL?#9_1: L?#9.1 Q?#10.2(S) Q?#11.3(D)
NetL?#11_1: L?#11.1 Q?#12.2(S) Q?#13.3(D)
NetL?#12_1: L?#12.1 Q?#14.2(S) Q?#19.3(D)
NetL?#13_1: L?#13.1 Q?#16.2(S) Q?#20.3(D)
NetL?#14_1: L?#14.1 Q?#23.2(S) Q?#26.3(D)
NetL?#14_2: L?#14.2 R?#53.2
NetL?#15_1: L?#15.1 Q?#24.2(S) Q?#27.3(D)
NetL?#16_1: L?#16.1 Q?#25.2(S) Q?#28.3(D)
NetL?#17_1: L?#17.1 Q?#30.2(S) Q?#33.3(D)
NetL?#17_2: L?#17.2 R?#68.2 R?#76.2
NetL?#18_1: L?#18.1 Q?#31.2(S) Q?#34.3(D)
NetL?#18_2: L?#18.2 Q?#32.3(D)
NetL?#19_2: L?#19.2 Q?#36.3(D)
NetL?#20_1: L?#20.1 Q?#45.2(S) Q?#46.3(D)
NetL?#20_2: L?#20.2 R?#101.2 U?#19.2(IN+)
NetM?#1_S: M?#1.S M?#2.D
NetM?#3_G: M?#3.G U?#11.3
NetM?#4_G: M?#4.G U?#15.3
NetN?#1_1: N?#1.1 R?#45.1 U?#6.2(IN+)
NetN?#2_1: N?#2.1 Q?#42.B R?#90.2 R?#96.1
NetN?#3_1: N?#3.1 Q?#43.B R?#91.2 R?#97.1
NetQ?#1_C: Q?#1.C R?#1.1
NetQ?#6_1: Q?#6.1(G) Q?#7.1(G)
NetQ?#13_2: Q?#13.2(S) R?#27.1 R?#48.2
NetQ?#18_B: Q?#18.B R?#29.2 R?#38.2
NetQ?#21_B: Q?#21.B R?#36.1 R?#40.2
NetQ?#21_C: Q?#21.C R?#29.1 R?#47.2
NetQ?#22_B: Q?#22.B R?#39.2 U?#6.3(OUT)
NetQ?#22_C: Q?#22.C R?#40.1
NetQ?#29_B: Q?#29.B R?#60.2 U?#8.3(OUT)
NetQ?#31_1: Q?#31.1(G) Q?#32.1(G)
NetQ?#35_B: Q?#35.B R?#75.2 U?#17.3(OUT)
NetQ?#36_1: Q?#36.1(G) Q?#37.3(D)
NetQ?#39_B: Q?#39.B R?#86.2 R?#89.1
NetQ?#39_C: Q?#39.C R?#93.1
NetQ?#40_B: Q?#40.B R?#88.1 R?#94.2
NetQ?#41_E: Q?#41.E Q?#42.C ZD?#13.K
NetQ?#43_C: Q?#43.C R?#89.2 ZD?#14.K
NetQ?#44_B: Q?#44.B R?#99.2 ZD?#12.A
NetQ?#44_C: Q?#44.C R?#94.1
NetQ?#45_1: Q?#45.1(G) Q?#46.1(G)
NetQ?#48_B: Q?#48.B R?#108.1 ZD?#23.K
NetQ?#48_C: Q?#48.C ZD?#24.A
NetQ?#49_B: Q?#49.B R?#113.1 ZD?#28.K
NetQ?#49_C: Q?#49.C ZD?#30.A
NetQ?#50_B: Q?#50.B R?#114.1 R?#118.2
NetQ?#52_B: Q?#52.B R?#121.2 ZD?#34.A
NetQ?#52_C: Q?#52.C R?#118.1
NetR?#12_1: R?#12.1 U?#1.1
NetR?#15_1: R?#15.1 U?#2.1
NetR?#34_1: R?#34.1 R?#35.2 U?#6.1(IN-)
NetR?#35_1: R?#35.1 R?#39.1
NetR?#42_1: R?#42.1 R?#43.2 U?#7.1(IN-)
NetR?#43_1: R?#43.1 R?#45.2 U?#7.3(OUT)
NetR?#46_1: R?#46.1 R?#51.2 R?#52.1 U?#5.1(IN-)
NetR?#49_1: R?#49.1 R?#50.2 U?#7.2(IN+)
NetR?#60_1: R?#60.1 R?#63.2 R?#64.1 U?#8.2(IN+)
NetR?#61_1: R?#61.1 R?#65.2 R?#66.1 U?#9.2(IN+)
NetR?#62_1: R?#62.1 U?#12.1 U?#13.2
NetR?#67_1: R?#67.1 U?#16.1
NetR?#67_2: R?#67.2 U?#16.2
NetR?#73_1: R?#73.1 R?#77.2
NetR?#75_1: R?#75.1 R?#79.2 U?#17.2(IN+)
NetR?#78_1: R?#78.1 R?#81.2 R?#82.1 U?#18.2(IN+)
NetR?#110_1: R?#110.1 ZD?#25.K
NetR?#116_1: R?#116.1 ZD?#31.K
NetU?#10_1: U?#10.1 U?#11.1
NetU?#11_2: U?#11.2 U?#12.3
NetU?#14_1: U?#14.1 U?#15.1
NetU?#15_2: U?#15.2 U?#16.3
NetU?#19_3: U?#19.3(OUT) U?#20.2(IN+)
NetU?#20_1: U?#20.1(IN-) U?#21.3(OUT)
NetZD?#1_K: ZD?#1.K ZD?#2.K
NetZD?#17_K: ZD?#17.K ZD?#18.K
NetZD?#19_K: ZD?#19.K ZD?#22.A
NetZD?#22_K: ZD?#22.K ZD?#23.A
NetZD?#24_K: ZD?#24.K ZD?#25.A
NetZD?#26_K: ZD?#26.K ZD?#27.A
NetZD?#27_K: ZD?#27.K ZD?#28.A
NetZD?#30_K: ZD?#30.K ZD?#31.A

Not connected (* = marked no-connect by the designer): 1V#1 K; 1V#2 K; ?#2 K; ?#5 K; ?#6 K; ?#7 K; C?#1 1; C?#6 1; C?#30 2; C?#31 1; D?#2 1(A) 2(K); D?#3 1(A) 2(K); D?#4 1(A) 2(K); D?#6 A; D?#12 1(A) 2(K); D?#13 1(A) 2(K); I?#1 1; I?#2 1; I?#3 1; I?#4 1; L?#10 1 2; M?#1 G; M?#2 G S; M?#3 D; M?#4 S; Q?#2 1(G); Q?#4 1(G); Q?#5 1(G); Q?#8 1(G); Q?#9 1(G); Q?#10 1(G); Q?#11 1(G); Q?#12 1(G); Q?#13 1(G); Q?#14 1(G); Q?#16 1(G); Q?#19 1(G); Q?#20 1(G); Q?#23 1(G); Q?#24 1(G); Q?#25 1(G); Q?#26 1(G); Q?#27 1(G); Q?#28 1(G); Q?#30 1(G); Q?#33 1(G); Q?#34 1(G); Q?#37 1(G); Q?#47 E; Q?#51 E; Q?#53 E; R?#2 1 2; R?#3 1; R?#8 1 2; R?#9 1 2; R?#10 2; R?#11 2; R?#13 1 2; R?#14 2; R?#16 2; R?#19 1 2; R?#20 2; R?#21 2; R?#80 1; R?#103 1 2; R?#104 2; R?#105 2; R?#110 2; R?#111 2; R?#116 2; R?#119 2; U?#1 3; U?#2 3; U?#3 1 2 3; U?#4 1(IN-) 2(IN+) 3(OUT); U?#9 1(IN-) 3(OUT); U?#13 1; U?#18 1(IN-) 3(OUT); U?#20 3(OUT); U?#21 1(IN-) 2(IN+); U?#22 1(IN-) 2(IN+) 3(OUT); V?#1 1; V?#2 1; V?#3 1; ZD?#1 A; ZD?#3 A K; ZD?#4 A K; ZD?#5 A K; ZD?#6 A K; ZD?#7 A K; ZD?#8 A K; ZD?#15 A K; ZD?#16 A K; ZD?#17 A; ZD?#21 K; ZD?#33 K; ZD?#36 K

## Notes on the sheet
- 1）我根据UC3842框图弄清楚每一个模块的一个逻辑
- 全分立UC3842步骤：
- 把每一个模块给我列出来（怎么实现的先不要管）
- 2）把整个UC3842原版内部的逻辑框图给我推导一遍
- 3）在原版UC3842内部逻辑框图的基础上把互补死区逻辑+FAULT做上去
- 4）每一个模块的原理图可以开始设计了（稳态电路设计）
- 6）对原理图进行整合，进行模块化设计，原理图上增加一些测试相关的东西
- 5）整个原理图整合进行逻辑时序的设计（电路板上电与断电逻辑设计）
- 7）元器件参数型号确定，数量按照5套采购回来
- ①
- ②
- UC3842 是一款经典的固定频率电流模式 PWM 控制器，内部集成 5V 精密基准源、振荡器、误差放大器、电流检测比较器、PWM 锁存器及大电流图腾柱输出驱动，通过电压外环（误差放大器比较输出电压与 2.5V 基准，输出 COMP 电压）和电流内环（逐周期比较开关电流峰值与 COMP 电平）构成双环串级控制，实现逐周期限流、快速动态响应和输入电压前馈补偿；其振荡频率由外接 RT/CT 设定，最大占空比被限制在约 96%，并具备欠压锁定（UVLO）和宽共模电流检测能力，广泛应用于反激、正激、Boost 等中小功率开关电源的 AC-DC 与 DC-DC 变换。
- 我们将UC3842分为2部分，第一部分为芯片辅助电路设计，第二部分为驱动电路设计
- 3.3V
- 输入波形相与后
- 死区生成
- 电路时序波形
- 输入
- 过压保护
- +
- 欠压保护
- 参考稳压器
- LDO输出5V
- LDO输出12V
- 逻辑信号建立(0~5V)
- VC驱动信号建立（5~12V）
- 后级正常工作后
- -
- MOS管驱动电路
- FOULT
- 三角波形成
- R端
- 阈值比较器
- （3.3V）
- NE555振荡器产生方波
- 得到的是理想状态下的低电平脉冲
- S端
- 触发比较器
- NE555输出取反
- 我们想要的是高电平脉冲
- 其次真正的脉冲在开通的时候由震荡
- 问题1：解决震荡问题
- 问题2：解决反向问题
- (near R?#3) NE555输出
- BUCK
- 同步整流电路
- 同步整流的BUCK
- PWM振荡器
- 窄脉冲
- NE555振荡器反向产生方波
- 通过三极管反向+滤波
- 需要考虑三极管的截止频率
- (near Q?#3) Q1
- (near Q?#2) Q1
- 将二极管使用mos管控制回路导通开关
- 比较器
- 电压环
- 第一段软启动
- 第二段软启动
- (near Q?#4) Q2
- MOSFET1 导通时：电流从 Vin​ 通过 MOSFET1 和电感 L 流向负载。
  电感 L 储能，MOSFET2 关断。
  MOSFET1 关断时：电感 L 通过 MOSFET2 续流，维持负载电流。
  MOSFET2 导通，提供低阻抗的电流通路。
- RS触发器R端
- 电流环
- COM端电压
- 1V
- S
- Q
- 死区互补
- 带有死区互补的同步整流BUCK
- TL431
- R
- 用与门做的互补死区（通过RC延时）
- Q1
- 关闭
- 导通
- 电压环和电流环相切
- 输入为低的时候
- RS触发器输出Q/
- 二极管
- Q2
- 电感电流
- 降压
- （1）搭建电路框架—实现基础功能——稳态运行正常
- 如何设计复杂的电路？
- RS触发器输出Q
- 输出电压（VOUT）
- A
- B
- C
- D
- 升压
- （2）分析上电和掉电
- 假设三个电源设计
- 输入为高的时候
- 5V欠压信号
- VBUS
- 24V
- 预驱
- 15V
- 逻辑信号
- 5V
- 问题一：使用mos管代替二极管的优缺点
- CLK
- RS触发Q/
- 或门
- 或门输出信号
- 上电：谁的电压低谁先建立
- 总非门取反
- 高速超大规模集成电路的尺寸的不断减小，功耗的不断降低，要求供电电压也越来越低，而输出电流则越来越大。
  ●电源本身的高输出电流、低成本、高频化（500kHz～1MHz）高功率密度、高可靠性、高效率的方向发展。
  ●在低电压、大电流输出DC-DC变换器的整流管，其功耗占变换器全部功耗的50～60％。
  ●用低导通电阻MOSFET代替常规肖特基整流/续流二极管，可以大大降低整流部分的功耗，提高变换器的性能，实现电源的高效率，高功率密度。
- 上桥RC延时
- ●用MOSFET来代替二极管在电路中的整流功能
  ●相对于二极管的开关算好极小
  ●整流的时序受到MOSFET的Vgs控制，可以根据系统的需要，把整流的损耗做到最小
- 2.5V
- (near ZD?#5) 4.4V
- (near ZD?#6) 3.7V
- 3V
- (near R?#13) 1V
- 问题二：为什么电感会出现负电流？以及如何监测负电流
- PWM上电时序
- 电压环和电流环的逻辑
- 上桥导通
- 下桥波形
- 当电感放电完后，电容开始反向给电感充电，产生反向的电流
- (near L?#3) 电感正向放电
- (near L?#4) 电容反向放电
- 电压采集是输出电容上的电压，电容的电压不会突变
- 状态1
- 状态2
- 0
- 1
- 稳态比较输出
- 保持
- 电流环和电压环的保护：
- 方案1：电压环拉低
- 电压环拉低占空减小
- 拉低占空减小
- 电压变化速率慢，所以是电压慢环，也就是说1ms监控一次
- 电流采集是输出电容上的电流，电容的电流会突变
- 电流变化速率快，所以是电流快环，也就是说1us监控一次
- 状态3
- 状态4
- 不稳定
- 方案2：电流环拉高
- 电流增大，电感的电流斜率变陡
- 电压环和电流环的保护与FAULT的关系：
- 下桥RC延时
- 电流是不能直接采样的，电流它是一个动能
- 动能不能直接采样，所以要使用采样电阻
- 状态1：初始上电时（系统未稳定），保持R和S为0，上一个状态未知，不知道保持什么
- 状态2：初始上电时（系统未稳定），上桥臂导通，下桥臂关断，我的Vc控制电压多半没建立，导通内阻大
- 状态3：初始上电时（系统未稳定），上桥臂关断，下桥臂导通
- 最大占空比及最小占空比设定
- 电压环是慢环是宏观量（用来调节占空比）
- 电流环是快环是微观量
- 下桥导通
- 比方河流中水的流速，我不能直接通过肉眼观察
- 我可以在水中加入漂浮瓶检测水的推力来间接计算
- 状态4：输出未知
- 方案一：检流电阻监测
- 方案二：在输出端添加三极管控制
- 两个mos管同时驱动
- 为什么选择状态三？
- 电源上电时序
- CLOCK
- (窄脉冲)
- (near Q?#5) Q1
- (near Q?#6) Q1
- (near Q?#7) Q3
- 外部电源
- V
- (电压环 - )
- ERROR
- 电流上升陡
- 12V驱动电路欠压
- (near Q?#8) Q2
- 驱动信号
- 12V
- SENSE
- (near U?#3) FOULT
- (near U?#3) PWM
- (near Q?#8) SRN
- (near ?#1) 检流电阻
- (near Q?#9) Q2
- 掉电：谁的电压低谁后跌落
- (电流环 + )
- SRP
- 初始上电时候，5V先建立，这个时候逻辑判断已经开始进行运行，但是12V驱动信号还没有建立成功
- 如果在12V未建立的时候，Vc电压如果只有8V，使用Vc进行Mos管控制，这个时候Mos管的导通内阻大
- 如果在12V未建立的时候，使用Vc进行Mos管控制，这个时候Mos管的导通内阻大
- LATCH
- 所以初始上电，电压电压没有稳定之前需要RS触发器保持在状态3
- OUTPUT
- 当监测到负电流流过时， 关闭Q2
- 缺点：还是会出现微小的负电流
- (near ZD?#7) 4.4V
- (near ZD?#8) 3.7V
- (near R?#19) 1V
- 上电时序设计：（方案一）
- 让R端在逻辑控制时输出始终为1
- 让S端在逻辑控制时输出始终为0
- 总结：电流环的电流上升斜率越陡，那么它的占空比是越来越小
- 占空比通过电流环和电压环相切，产生PWM
- 当12V电压建立起来后释放掉
- 上电时序设计：（方案二）
- 在FAULT信号上做文章
- 方案1：电压环控制
- 方案2：电流环+电压环控制
- 异步整流：续流二极管的导通和关断是 被动 的，与开关管的动作不同步，因此称为“异步”。
- 同步与非同步整流
- 问题三：电感平均电流大于0和小于0是什么模式
- (near U?#4) 电压环
- 如果上电期间FAULT拉低，则MOS管关闭
- 直流电平（电压环）
- 相切
- PWM
- 电压和电流都参与进行控制
- 同步整流：续流 MOSFET 的导通和关断是主动的，与开关管的动作严格同步，因此称为“同步”
- (near L?#7) 电感正向放电
- (near L?#8) 电容反向放电
- 针对FAULT信号进行处理
- 三角波（电流环）
- 产生一个固定占空比的时钟频率
- 电流斜波（电流环）
- 带隙基准2.5V
- 初始上电时，电压会被拉低，然后再缓慢升高到5V
- 为什么初始上电需要拉低一下
- 频率取决于开关电源的震荡频率
- 确定了一个电压的范围值（类似于判断条件）
- UC3842内部（RS触发器）底层逻辑
- 这一下并不是真正做的FAULT拉低逻辑
- 这部分类似于给一个初始状态
- 5V电压建立需要时间
- 如果直流电平和三角波都是静态的，那么负载也只能是静态的
- 本质是输出电压的反馈
- 降压区
- 意味着电感电流斜坡中心值（平均值)高于横轴（为正)
- 暗示着净能量/净电流从左侧（高压端）流向右侧（低压端)
- 第一阶段：0~5V期间
- 担心5V建立的时候突然就为高电平
- 这个时候我的FALUT信号还没有建立好
- 一是5V电压没有稳定的时候FAULT处于失效的状态，需要拉低
- 我们这时候必须引入负反馈
- 我们的应用都是争对一个负载可变的电源
- 后级负载发生变化时，能够及时更新PWM
- 本质是电感电流的实时镜像，反映开关管瞬时电流的上升斜率
- 升压区
- 意味着电感电流斜坡中心值（平均值)低于横轴(为负)
- 暗示着净能量/净电流从左侧（高压端)流向右侧（低压端)
- FAULT电压建立5V也需要一定时间，可以通过电容大小来实现
- 二是加入电容能够保证初始状态是已知的
- 负反馈采样点的确定，是我们监视的对象
- 如果我们想做电压源，那么输出电压就是我们的观察对象
- 负载变化时 → 输出电压变化 → VFB 变化 → 误差放大器调整 COMP → 改变电流峰值阈值 → 占空比变化
- 如果 直流电平和电流斜坡都是静态的 → 固定峰值电流，固定占空比
- 注意：现在是在分析电流波形，暂时不分析电压波形是什么样子
- 首先确定电流流向是由高电位向低电位
- (near L?#10) 当电感上的平均电流大于0时，说明是降压模式
- (电压环)
- 第一阶段是0~5V期间，我们的FAULT还没有建立
- 第二阶段是5~12V期间，逻辑电路已经建立
- FAULT处于失效阶段
- FAULT信号需要拉低，FAULT信号已经能够被控制
- 如果我们想做电流源，那么输出电流就是我们的观察对象
- 输出电压是电压慢环，采样点是我的电容上的输出电压
- 输出电流是电流慢环，采样点是我的电容上的输出电流
- 方案的优势
- 电流内环是快环：逐周期限流，天然过流保护。
- 电感电流实时控制，电流超过额度，本周期立即关断，不会等电容电压上升。
- (near Q?#10) Q1
- (near L?#9) 负
- 如果不加以控制，电流在电感上的电流是有正有负的
- 形成了LC谐振，电容给电感充电
- 方案一：负电流检测
- 高
- (near L?#10) 现在降压变换器中出现了升压模式
- (near L?#10) 输入
- (near L?#10) 输出
- 低
- (near C?#15) 有隐患
- 这里需要将FAULT和12V建立联系
- 当12V建立稳定前，我FAULT信号拉低
- 当12V建立后，FAULT信号释放，被5V拉高
- 真正的电流内环
- 输出电压
- 采样点
- 实时控制的电感电流的环是我的电流内环
- 输入电压前馈：输入电压变化 → 电感电流斜率变化 → 自动调整占空比，无需等电压环反应。
- 方案的缺陷：
- 占空比 > 50% 时：需引入斜坡补偿（Slope Compensation），否则会产生次谐波振荡
- (near Q?#11) Q2
- 我们需要对负电流进行检测并进行控制
- (near L?#10) 轻载运行时，在开关周期的大部分时间里，同步降压变换器的表现一直如同升压变换器
- (near L?#10) 越轻载，负电流深度越深
- 越重载，负电流深度越浅（重载一定程度后变成了连续)
- (电流环)
- 保护的地方能用数字就不用模拟的方式去失效
- 模拟的保护不能和数字的保护混为一谈
- 这套方案就决定了输出电压作为反馈量
- 静态
- 轻载问题：电感电流不连续（DCM）时，电流环特性变化，可能需跳脉冲或变频
- 正
- 上图这个拓扑是降压不是升压，仅仅是因为按照电流波形所示，降压从整体上“胜出”
- 问题就是上面的BUCK拓扑我们仍然称为降压，不是升压?
- 实际上，降压和升压拓扑电路相同，只是功能不同
- 电压环和电流环没有相切
- 输出占空比为100%
- 模拟的东西去拉数字的东西容易让数字电平产生放大区
- 模拟下的保护控制信号只能去拉低模拟信号
- 我的一个理想状态是用数字电路去做它的逻辑0~5V的消隐
- 电压型开关电源控制方式是天然的有缺陷
- 这套方案只是采样输出电压来反馈来产生PWM
- 输出电压是慢环，反馈点在电解电容上的电压
- 消隐是消除或者屏蔽掉电路中一段时间的干扰
- 模拟保护肯定是做变化的量的保护
- 这里可以使用电容的电压不能突变来实现
- 只有在N个周期后才能产生明显变化
- 电流就没有得到限制
- 电压控制型控制具有滞后型
- (near Q?#12) Q1
- (near L?#11) 负
- NE555脉冲输出端
- 分析一：A、B、C、D4种模式的电流走向分析
- 脉冲信号
- S端信号
- 当电感上电流超标，再反馈到输出端的电容
- 电容的电压上升，在反馈调整
- 根据电感的伏秒平衡，拓扑自动实现了电流的平衡
- 缺陷：电感的电流不能实时控制
- (near Q?#13) Q2
- 电流增加
- A模式
- (near Q?#14) Q1
- B模式
- 电压
- （比较器-端）
- 反馈电压波形
- 5V电压肯定比3.3V先建立
- 能抗过去就抗过去，不能抗就坏了
- 如果电流超过了额度，对功率管的要求比较高
- (near Q?#16) Q1
- (near L?#12) 电流减小
- 电流
- （比较器+端）
- 检流电阻波形
- 此时会出现1，这种在PWM高时出现1是不允许的
- 同时我们希望PWM的高信号越窄越好
- 重载波形被拉低
- 初始上电为低
- 5V电压建立后，立刻将将FAULT电压拉低
- 芯片只有在正常上电的时候，才能正常工作
- 比较器脉冲波形（R端）
- 但是我们要确保PWM的宽度能够被识别
- (near R?#38) 锁死NE555脉冲输出端
- (near Q?#20) Q2
- (near Q?#19) Q2
- （实现PWM控制mos管）
- RS触发器输出
- (near R?#46) 滞回比较
- 不复位意味着你做的逻辑有可能失效
- (near C?#23) 凡是电容的地方都要进行电压复位
- 峰值电流检测
- 无电流时输出为0V
- 输出给RS触发器的S端
- A阶段，首先从输入端提取能量储存在电感中
- B阶段，电感储存能量释放
- PWM的脉冲信号决定了我们的周期
- (near Q?#23) Q1
- (near L?#14) V
- (near R?#53) V
- C模式
- 电流减小
- D模式
- 总结：
- PWM的高电平宽度不起什么作用，只是让RS触发器产生逻辑
- 脉冲信号S端只要保持一点宽度就可以了
- 电流电压的交点是我们的占空比变化的点
- 这个电容只负责初始上电的时候拉低
- R+
- (near R?#53) R-
- v=Io *R
- Vo+V
- (near R?#48) 有干扰
- (near R?#50) 放大100倍
- (near Q?#25) Q1
- (near Q?#24) Q1
- （1）电流环切到电压环输出下桥臂导通
- （2）电流环没切到电压环输出上桥臂导通
- 只要起始刻我是0（R）你是1（S），那么就置1了之后就锁存了
- 脉冲信号在这里只是起到一个触发作用
- 脉冲信号S只要窄到RS触发器能够识别就行
- 当比较器正输入端大于负输入端，输出为高
- R-
- Vo
- 一旦有负电流之后可以使用负电流检测
- 同时将NE555锁死
- 初始上电使用NE555振荡器生成窄脉冲
- (near L?#16) 电流增加
- 实际占空比的宽度与脉冲信号（S）无关，实现占用比只与电流电压相交有关
- (near Q?#26) Q2
- 时间
- 缺点：会存在一个很小的负电流
- 优点：可以用此负电流做上管的软开关，0电压导通、
- (near Q?#28) Q2
- (near Q?#27) Q2
- 在5V建立后，逻辑电路开始进行工作
- 这时候12V电压通过分压到正输入端
- C阶段新电流方向判断，电路开始从输出端提取能量储存在电感中
- D阶段，储能/电流释放到输入电容
- 欠压保护信号
- FAULT信号持续拉低
- 正输入大于负输入电压，输出端接5V
- 输出电压并联分压得到2/3Vref
- 检流电阻采样点
- 0A
- 问题:根据定义，这不就成了升压变换器了吗?
  随时从低端提取能量，再传输到高压端
- 越轻载负电流深度越深，越重载负电流深度越浅(重载一定程度后变成了连续)
- 从A阶段开始再次循环，能量再次从高压端传输到低压端
- (near U?#13) 0
- (near U?#13) 1
- (near U?#12) 1
- (near U?#12) 0
- (near U?#11) 1
- (near U?#11) 0
- (near R?#65) 3.3V
- 我们需要考虑检流电阻两端的电压波形是什么样子的
- 将电感电流通过检流电阻转换成电压进行采样保护
- 方案二：MOS管同步开关
- 同步降压拓扑和同步升压拓扑使用同步(互补）驱动时，传统的断续导通模式被一种新的连续导通模式所取代
- (near U?#15) 0
- 两个驱动信号同步
- 我们可以认为降压拓扑的负电流就是升压拓扑的正电流
- 该模式下，大量的能量在每个周期内简单地循环往复，实际上只有很少的能量（也许为零)从输入端传输到负载
- 循环能量并不一定高效（没事瞎忙活)，这也是同步（互补）驱动不合适电池供电场合的原因
- (near U?#16) 0
- (near U?#16) 1
- (near U?#15) 1
- 当比较器正输入端小于负输入端，输出为低
- 12V电压建立过程
- (near Q?#30) Q1
- (near L?#17) V
- (near R?#68) V
- (near R?#68) R-
- (near Q?#31) Q1
- 当平均电感电流降至零以下时，同步降压拓扑变换成同步升压拓扑
- 如果现在是升压变换器，那么C阶段和D阶段将在传统方式下运行(正电流)
- 互补驱动情况下，电压波形是相同的，但是电流波形不但要镜像反射，而且要垂直平移
- (near Q?#34) Q2
- 交叉损耗又是什么情况?
- 我们常说开关拓扑中，控制场效管有交叉损耗，但同步场效应管(钳位二极管）没有
- 降压变换器工作在升压模式(负电流)时，Qs在每周期的升压部分产生损耗，而不是Q
- 解决思路:
- 最好的解决思路是什么呢?
- 该导通时给我导通，不该导通时不要给我导通
- 我可以在电感后面增加一个主动开关(mos管)
- 当比较器的正输入电压大于负输入端电压后，输出比较器输出电压为5V
- (near Q?#33) Q2
- (near Q?#34) SRN
- (near ?#3) 检流电阻
- 为什么同步整流必然会出现负电流?
- 是不是因为你开关是主动控制的，你开了之后你怎么知道什么时候电流为0?
- 本质上主动器件可以双向导通所以你不清楚电流什么时候为零
- 让mos与主动mos同频不就能实现吗
- 还有一种方案就是滞后控制思路
- 负输入端电压变成1/3V，输出电压低于1/3Vref时关闭
- (near R?#76) Vo+V
- (near ?#4) Vo
- (near R?#82) 1.7V
- 分析二：同步整流BOOST波形和模式分析
- (near L?#19) Q1
- 同步整流的BOOST
- (near Q?#36) Q1
- 结果是平均值（和极性）改变只有这样，才能从功能上得到升压变换器，而非降压变换器
- 目前大家都可以正式地研究降压拓扑究竟如何才能转换成升压拓扑
- Vo-0.6V
- 同步降压拓扑的平均电感电流降至横轴以下
- 那么同步降压拓扑就变成同步升压拓扑，但电压波形不变（指的是互补的电压波形)
- 升压拓扑中的电感储能是在原降压拓扑的关断时间内建立起来的（尽管电流反向)
- 因此，这段时间现在正式成为升压拓扑的导通时间
- RS触发器Q/端
- (near Q?#37) Q2
- 所以，现在实际上Ton变成了Toff，Toff变成了Ton，意味着D变成了1-D
- 并且输出变成输入，输入变成输出
- O
- IN
- 根据平均值进行讨论
- 1-D
- BOOST
- 三输入或门输出
- 根据模拟电流续断可得比较器：
- 带有死区互补的同步整流BOOST
- 肖特基二极管
- 拉电压外环
- R2两端的电压：
- Vo -
- （Vo-0.6V）
- 0.6V
- 初始上电拉PWM
- 因此电压VR+：
- R1+R2两端的电压：
- R1+R2
- R2
- 上管体二极管在导通
  死区期间电感电流维持上一模态
  死区上一模态就是C模态
- 高侧取反
- (near Q?#42) 电压环保护触电
- (near R?#97) 电流环保护触电
- 由上面的波形可得
- Buck-Boost模式通过叠层载波方法：
- 载波叠层电压控制模式
- 高侧与门上输入
- 软启动电容
- I
- LIM
- *
- R1
- -   0.6V
- 把BUCK的PWM载波放到下层
- 然后把BOOST的PWM载波放置到上层
- 当Vin>Vout时，控制电压Vc处于下层的Buck PWM载波
- 当Vin<Vout时，控制电压Vc处于上层的Boost PWM载波
- 那么控制电压Vc是如何从下层移动到上层的呢？
- 假设输出电压Vout不变，刚开始处于Buck模式
- 高侧与门下输入（RC延时）
- 峰值电流控制模式
- 随着输入电压Vin的减小，反馈使得控制电压Vc增大以增大占空比
- 当Vin继续减小，控制电压Vc继续增大，就从Buck PWM载波层来到了Boost PWM载波层
- 恒频同步升压
- 电路设计的所有功能和逻辑部分的电路，都需要考虑上电时序带来的问题
- 电压环软启动的本质:电压不能突变，电压需要缓慢的变化
- 不做软启动的情况：
- (near Q?#45) Q1
- Boost载波
- 高侧与门输出
- 电压环建立
- (near L?#20) V
- (near R?#101) V
- (near R?#101) R-
- Buck载波
- 模式切换过度
- 如果不进行软启动，当后级工作后，占空比上电就达到100%
- 容易导致磁性器件保护电容饱和
- 缺陷是中间有一个过渡电压，如果在这个红色虚线下，如何处理
- 叠层载波原理
- 低侧与门上输入
- 电压环软启动
- 占空比变化
- (near Q?#46) Q2
- 类似与开车换挡，很少一开始一脚油门
- 希望的占空比波形
- 驱动电路
- (near U?#19) 差分放大
- 低侧与门下输入（RC延时）
- (near U?#20) R
- 低侧与门输出
- (near U?#20) 比较器
- (near ZD?#15) 4.4V
- (near ZD?#16) 3.7V
- (near R?#103) 1V
- (near U?#21) 误差放大
- 通过波形分析可以发现两者之间通过延时实现了死区的生成
- (near U?#22) 电压环
- 次谐波振荡
- 核心：当占空比大于0.5,电感电流发散，误差周期刚好两倍于开关周期
- 第一阶段：0~5V期间(第一段软启动设计)
- 第一阶段：0~5V期间(第二段软启动设计)
- 在刚开始上电时候，整个系统逻辑还没有工作
- 也就是说需要5V供电的数字部分以及部分模拟电路是不工作的
- (near ZD?#20) ①
- 这个时候LDO的Vref输出电压在0~5V上升期间
- 当Vref为0V~5V时，PNP三极管的基极电压也从0~5V
- 由于三极管具有截止放大导通三个阶段
- 基极电压会被钳位到1.8V
- 最小工作电压为：1.8V
- 因为三极管的本质是对源电流驱动能力的改变，类似于可变电阻
- 代表着阻值是由短路向断路的变化过程
- 由于电流钳位法可得，电压环的电压会由小变向稳定
- 然后一个Vbe导通压降0.6V
- 3*Vpn - Vbe
- TL431，那电压环哪里来的电压初始上升
- Vref开始上升时，开始给电容进行缓慢充电，实现电压环的第一阶段软启动
- 这个时候就有一个疑问，很多逻辑电路都是5V后开始工作
- Ie =
- 1200R
- 1.8V
- (near Q?#48) 1.2V
- 这个时候需要来分析一下电压环的整体上电工作状态了
- (near ZD?#24) 4.4V
- (near ZD?#24) 3.7V
- (near R?#110) 1V
- 在0~5V期间，当LDO输出电压上升到1.8V的时候，PNP三极管导通
- 同时下面的,最小导通压降为1.4V
- Vref建立（5V）
- 这个时候电压环电压开始进行上升
- 也就是说当电压环的在0~5V期间也是开始上升的
- 我们发现这个电路必须在4.4V的时候才能输出1V
- 如果我们直接使用输入电压24V输入LDO输出5V，是否可行？
- 这里需要考虑各个供电电压的建立
- 那我们的软启动电路是如何工作的，是不是多余的呢
- 软启动电路看起来是通过PNP去拉电压环
- 本质是使用RC延时来延迟电压环起步时间（延时启动）
- 压差有19V，我们使用全分立做LDO本身的电流供电其实不小
- 电路内部所有逻辑都是基于5V设计的，对电流需求不小
- 为什么我们内部的逻辑控制使用5V来做？
- 软启动的电压需要考虑在这3个电压区间的变化
- 第一个阶段：0~5V逻辑电压源形成
- 先是0~5V内部逻辑电压建立，然后就是0~12V驱动电压建立
- (near Q?#49) 1.2V
- COMPmin：1.4V，最小工作导通电压
- (near ZD?#30) COMPpin：4.4V，电压环电压为1V开始工作
- 虽然使用的同一个电压源：电容上的电压上升时间肯定要滞后于电压环电压形成
- 因为电压越低逻辑时许建立越快
- 这就是为什么电脑芯片供电电压越低的原因之一
- 第二个阶段：5V电压源建立，逻辑控制开始工作
- 这个阶段类似于一个健壮的成人，精力和身体素质旺盛，正是奋斗时
- 这个阶段相当于一个在成长的小孩，精力和身体素质有限
- (near ZD?#30) 4.4V
- (near ZD?#30) 3.7V
- (near R?#116) 1V
- (near ZD?#29) ①
- 为什么不使用更多的电压，比如芯片的供电为1.8V
- 因为我们使用的是分立器件去做的，分立器件都有导通阈值
- 为什么是1.8V，不是低于1V之类的电压？
- 第三个阶段：5~12V建立过程，内部控制电路开始工作，系统希望越快趋于稳定
- 这个阶段类似与事业飞升期间，能够不断得到提升
- 是不是可以更加快速的管理我们的系统
- (near C?#44) 软启动电容
- 经典的带隙基准电路会产生一个与温度和电源电压无关的稳定电压
- 除了带隙基准电压，还需要考虑后级输入输出的控制
- 这个值通常被设计在 1.2V - 1.25V 之间
- 第四阶段：12V成功建立，系统实现最终稳定工作
- 整个人生达到巅峰，生活整体趋于稳定
- 这里面的软启动电路是需要去调整的
- 原因是我们知道当电压固定不变的时候，电容电压是有拖尾效应的
- 如果需要设计1V一下的电压，需要对带隙基准进行特殊处理，成本更高
- 1.2V + “工作空间” = 1.8V，输入对管需要一定的电压余量才能导通
- 供电电压固定
- (near C?#46) 0V
- (near ZD?#35) ①
- 三极管打开后，NPN三极管处于饱和状态，软启电容开始快速充电
- 当供电电压上升到3.3V的时候，然后RC延时后，再控制NPN三极管打开
- 电容的充电斜率（充电电流）是由电容正级和电压源2端的压差决定（等效电阻值固定）
- 但是我们的Vref电压还在上升，这就导致我们的电容电压波形一直趋向于拖尾部分的电压变化
- 电容的电压建立就会远远大于Vref（5V）的建立时间，导致我们的电压环软启动时间过长
- 红色是Vref建立
- 橙色是第一段软启动
- 绿色是第二段软启动
- 电压环软启动时间过长，那我们这个电压初始上电的瞬态响应不好
- 这时候需要引入第二段软启动
- 5V电压源建立，逻辑控制开始工作
- 我们通过5V电压将这段软启动关闭，让更加强壮的人来控制
- 加快电压环的建立
- Labels drawn without touching a wire or pin: GND

## Library data of the parts
1V#1 1V#2 ?#2 ?#4-?#7 ZD?#3-ZD?#8 ZD?#12 ZD?#15 ZD?#16 ZD?#24 ZD?#25 ZD?#30 ZD?#31 ZD?#34 = DIO_ZENER_4: 15V稳压管; Brand: 10V; Part Number: *
?#1 ?#3 ESR? R?#24 R?#26-R?#29 R?#34-R?#43 R?#45 R?#47-R?#50 R?#53 R?#68 R?#73 R?#76 R?#77 R?#83 R?#85 R?#101 = Resistor: TC1: 0; SimulationGenericComponent: True; TC2: 0
C?#1 C?#6-C?#8 C?#41 = CAP_CC_SMD_4: 物料号: *; 物料描述: *
C?#2 C?#15 C?#23 C?#25 C?#40 C?#45 = CAP_CC_SMD_5: 物料号: *; 物料描述: *
C?#3 C?#22 C?#29-C?#31 C?#34 C?#38 = CAP_CC_SMD_3: 物料号: *; 物料描述: *
C?#4 C?#5 C?#9-C?#14 C?#16-C?#21 C?#24 C?#26-C?#28 C?#32 C?#33 C?#35-C?#37 C?#42 C?#46 = Capacitor: SimulationGenericComponent: True
C?#39 C?#43 C?#44 C?#47 = CAP_CC_SMD_2: 品牌: muRATA; Part Number: *; 供应商物料号: *; 型号规格: *
D?#1-D?#4 D?#12 D?#13 = 1N4148W_C7420318: Symbol: 1N4148W_C7420318
D?#5 D?#6 D?#8-D?#11 D?#14-D?#17 = DIO_COMMON: 肖特基二极管/40V/1A; 品牌: IN4007; Part Number: *; 供应商物料号: *; 规格型号: *
D?#7 = DIO_LED: Brand: LED; Part Number: *
H?#1-H?#3 = pz254v-11-02p: 插针结构:1x2P;间距:2.54mm;行距:-;圆针/方针:方针;安装方式:直插;排数:单排;总PIN位数:2P;额定电流:3A;额定电压:250V;配合针长度:6mm;塑高:2.5mm;端接针长度:3mm;触头材质:黄铜;触头镀层:-;工作温度:-40℃~+105℃;颜色:黑色;; Manufacturer: XFCN(兴飞); AddInBom: yes; ModelId: e35305ec3aa84b66b849f914b715e73f; ModelName: HDR2.54-M-LI-1X2P; ModelTransform: 200,100,0,0,0,0,0,0,-118.11; Pin Structure: 1x2P; Pitch: 2.54mm; Circluar Pins/Square Pins: 方针; Current Rating: 3A; Voltage Rating (Max): 250V; Symbol: PZ254V-11-02P; LCSC Part Name: 1x2P 间距:2.54mm 方针 直插; SupplierPart: C492401; ManufacturerPart: PZ254V-11-02P; Supplier Footprint: 插件,P=2.54mm; JLCPCB Part Class: Extended Part; Datasheet: https://item.szlcsc.com/datasheet/PZ254V-11-02P/502957.html; Supplier: LCSC; ConvertToPcb: yes; FootprintName: HDR-TH_2P-P2.54-V-M; Row Spacing: -; Mounting Type: 直插; Number of Rows: 单排; Number of Pins: 2P; Length of Mating Pin: 6mm; Insulation Height: 2.5mm; Length of End Connection Pin: 3mm; Contact Material: 黄铜; Contact Plating: -; Operating Temperature: -40℃~+105℃; Color: 黑色
I?#1-I?#4 = AC Current Source: SimulationGenericComponent: True; DC: 0; Phase: 0
L?#1-L?#20 = Inductor: SimulationGenericComponent: True
M?#1-M?#4 = Nmos_1: 1个N沟道 耐压:40V 电流:45A
Q?#1 Q?#17 Q?#18 Q?#22 Q?#38 Q?#42-Q?#44 Q?#52 = BJT_NPN_1: Part Number: *; Brand: *
Q?#15 Q?#21 Q?#29 Q?#35 Q?#40 Q?#41 Q?#47 Q?#50 Q?#51 Q?#53 = BJT_PNP_1: Part Number: *; Brand: *
Q?#39 Q?#48 Q?#49 = BJT_PNP: PNP/30V/3A; Part Number: *; Brand: *
R?#1 = R-0603-100Ω-5%_16: 片式电阻; 物料描述: 片式电阻器-0805-10KΩ-5%-JT; 物料号: NA
R?#2 R?#5 R?#8 R?#12 R?#15 = R-0603-100Ω-5%_2: 片式电阻; 物料描述: 片式电阻器-0805-10KΩ-5%-JT; 物料号: NA
R?#3 R?#4 = R-0603-100Ω-5%_15: 片式电阻; 物料描述: 片式电阻器-0805-10KΩ-5%-JT; 物料号: NA
R?#6 R?#7 R?#17 R?#18 R?#23 R?#25 R?#31 R?#33 R?#54-R?#56 R?#69 R?#70 R?#84 R?#102 = 3296W-1-103_C48997937: Symbol: 3296W-1-103_C48997937
R?#9 R?#10 R?#13 R?#14 R?#19 R?#20 R?#22 R?#30 R?#103 R?#104 R?#110 R?#111 R?#116 R?#119 = R-0603-100Ω-5%_1: 片式电阻; 物料描述: 片式电阻器-0805-10KΩ-5%-JT; 物料号: NA
R?#11 = R-0603-100Ω-5%_8: 片式电阻; 物料描述: 片式电阻器-0805-10KΩ-5%-JT; 物料号: NA
R?#16 R?#21 R?#51 R?#52 R?#63-R?#66 R?#79-R?#82 R?#105 = R-0603-100Ω-5%_5: 片式电阻; 物料描述: 片式电阻器-0805-10KΩ-5%-JT; 物料号: NA
R?#32 R?#44 R?#57 R?#58 R?#71 R?#72 R?#86 R?#88-R?#94 R?#96-R?#100 R?#109 R?#114 R?#117 R?#118 R?#120 R?#121 R?#123 = R-0603-100Ω-5%_7: 片式电阻; 物料描述: 片式电阻器-0805-10KΩ-5%-JT; 物料号: NA
R?#46 R?#60 R?#61 R?#75 R?#78 = R-0603-100Ω-5%_3: 片式电阻; 物料描述: 片式电阻器-0805-10KΩ-5%-JT; 物料号: NA
R?#59 R?#74 = R-0603-100Ω-5%_9: 片式电阻; 物料描述: 片式电阻器-0805-10KΩ-5%-JT; 物料号: NA
R?#62 R?#67 = R-0603-100Ω-5%_13: 片式电阻; 物料描述: 片式电阻器-0805-10KΩ-5%-JT; 物料号: NA
R?#107 R?#108 R?#112 R?#113 = R-0603-100Ω-5%_6: 片式电阻; 物料描述: 片式电阻器-0805-10KΩ-5%-JT; 物料号: NA
U?#1-U?#3 U?#11 U?#12 U?#15 U?#16 = Digital AND: rise_delay_inst: 1n; input_load_inst: 1p; SimulationGenericComponent: True; fall_delay_inst: 1n
U?#4-U?#6 U?#8 U?#9 U?#17-U?#22 = OpAmp: SimulationGenericComponent: True
U?#7 = OpAmp with power terminals: SimulationGenericComponent: True
U?#10 U?#14 = Digital 1: SimulationGenericComponent: True; adc_rise_delay_inst: 1n; adc_fall_delay_inst: 1n
U?#13 = Digital NOT: rise_delay_inst: 1n; input_load_inst: 1p; SimulationGenericComponent: True; fall_delay_inst: 1n
V?#1-V?#3 = Battery: SimulationGenericComponent: True
ZD?#1 ZD?#2 ZD?#9-ZD?#11 ZD?#13 ZD?#14 ZD?#17-ZD?#23 ZD?#26-ZD?#29 ZD?#32 ZD?#33 ZD?#35 ZD?#36 = DIO_ZENER_2: 15V稳压管; Brand: 10V; Part Number: *
COMP?#1 COMP?#2 N?#1-N?#4 = 测试点: value: *
Q?#2-Q?#14 Q?#16 Q?#19 Q?#20 Q?#23-Q?#28 Q?#30-Q?#34 Q?#36 Q?#37 Q?#45 Q?#46 = 2N7002,215: Symbol: 2N7002,215
R?#87 R?#95 R?#106 R?#115 R?#122 = 3296W-1-103_C48997937: Symbol: 3296W-1-103_C48997937